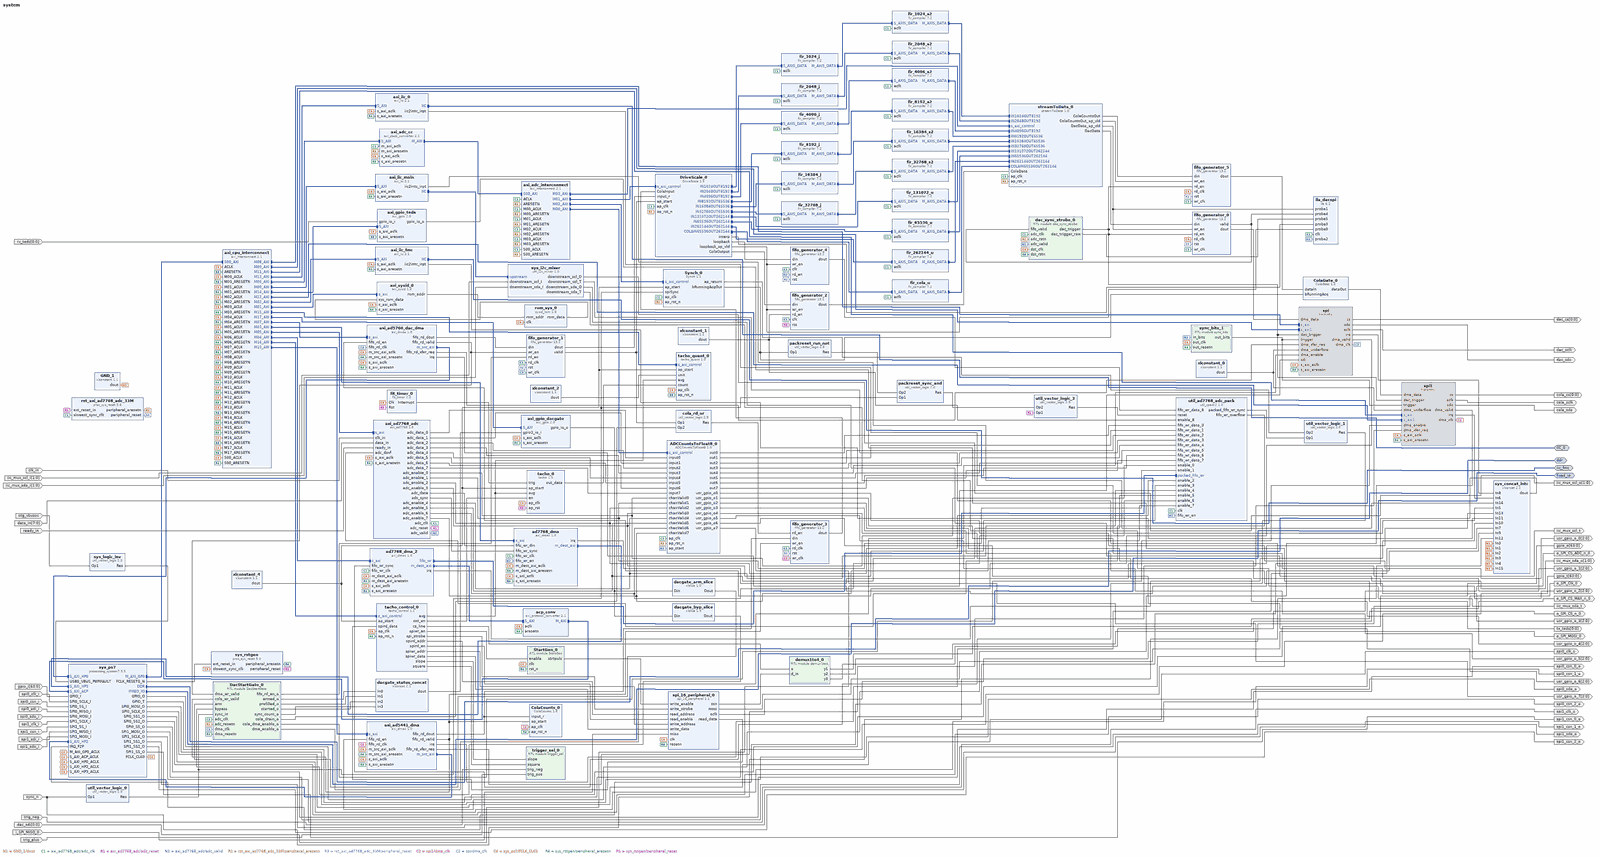
[diagram p0: block diagram of the top level, whole]
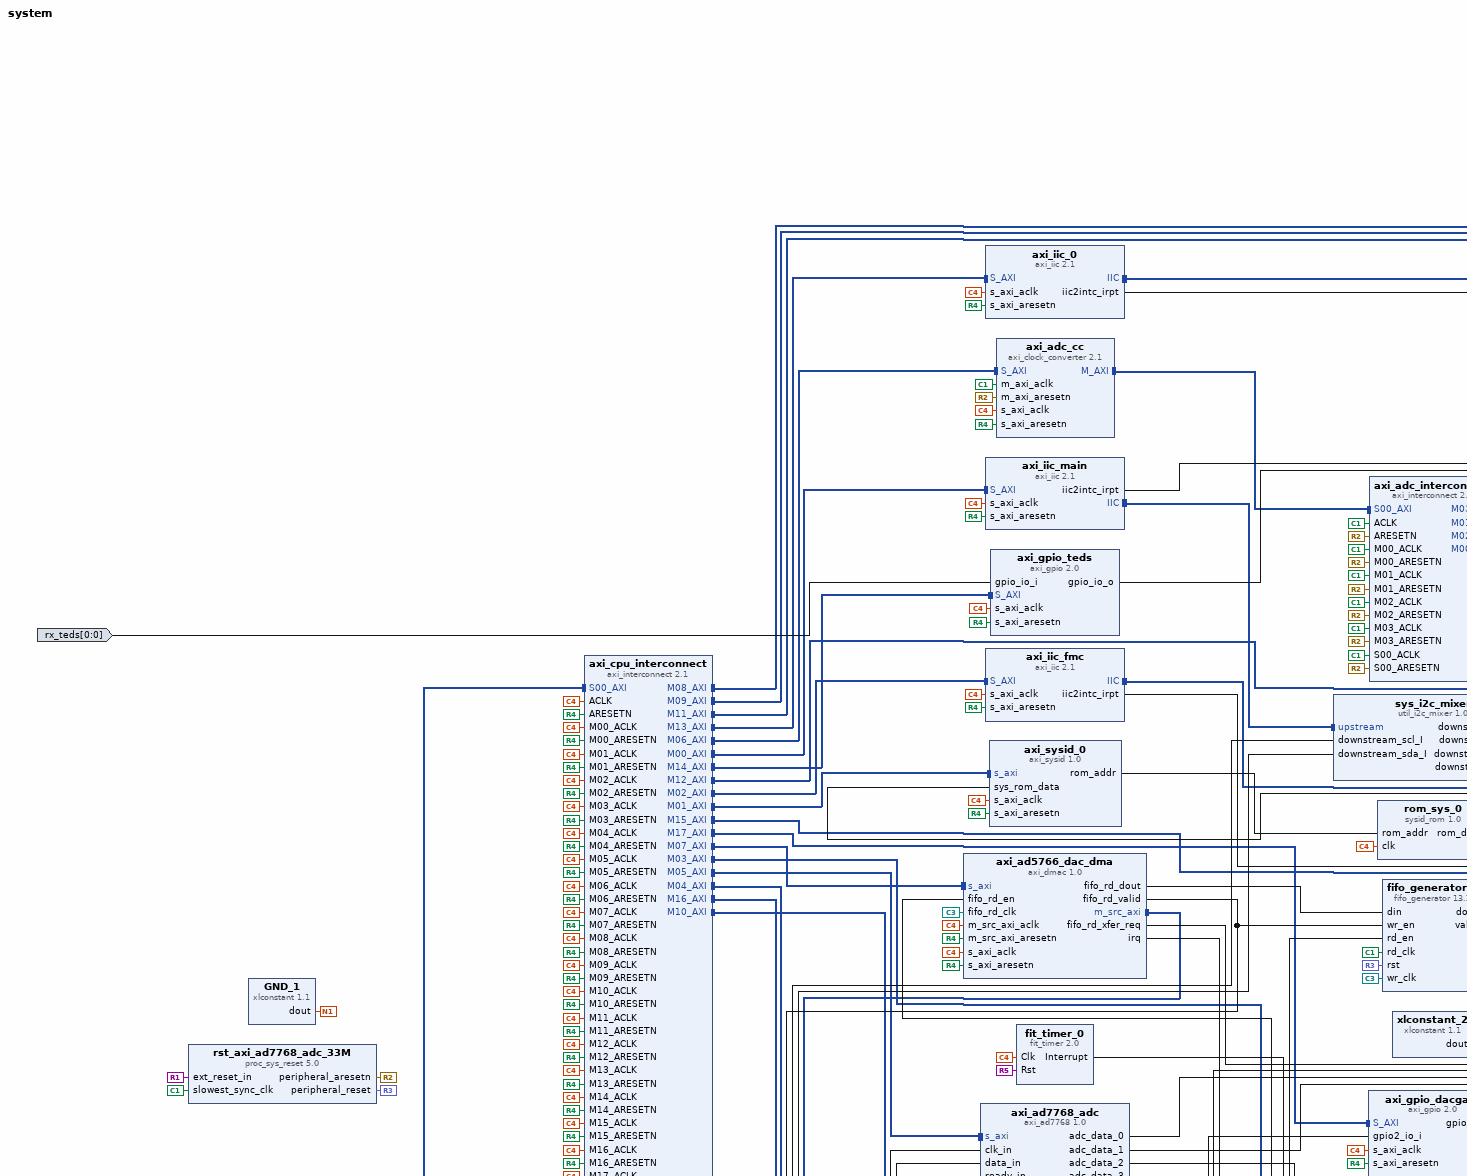
[diagram p1: block diagram of the top level, upper left part]
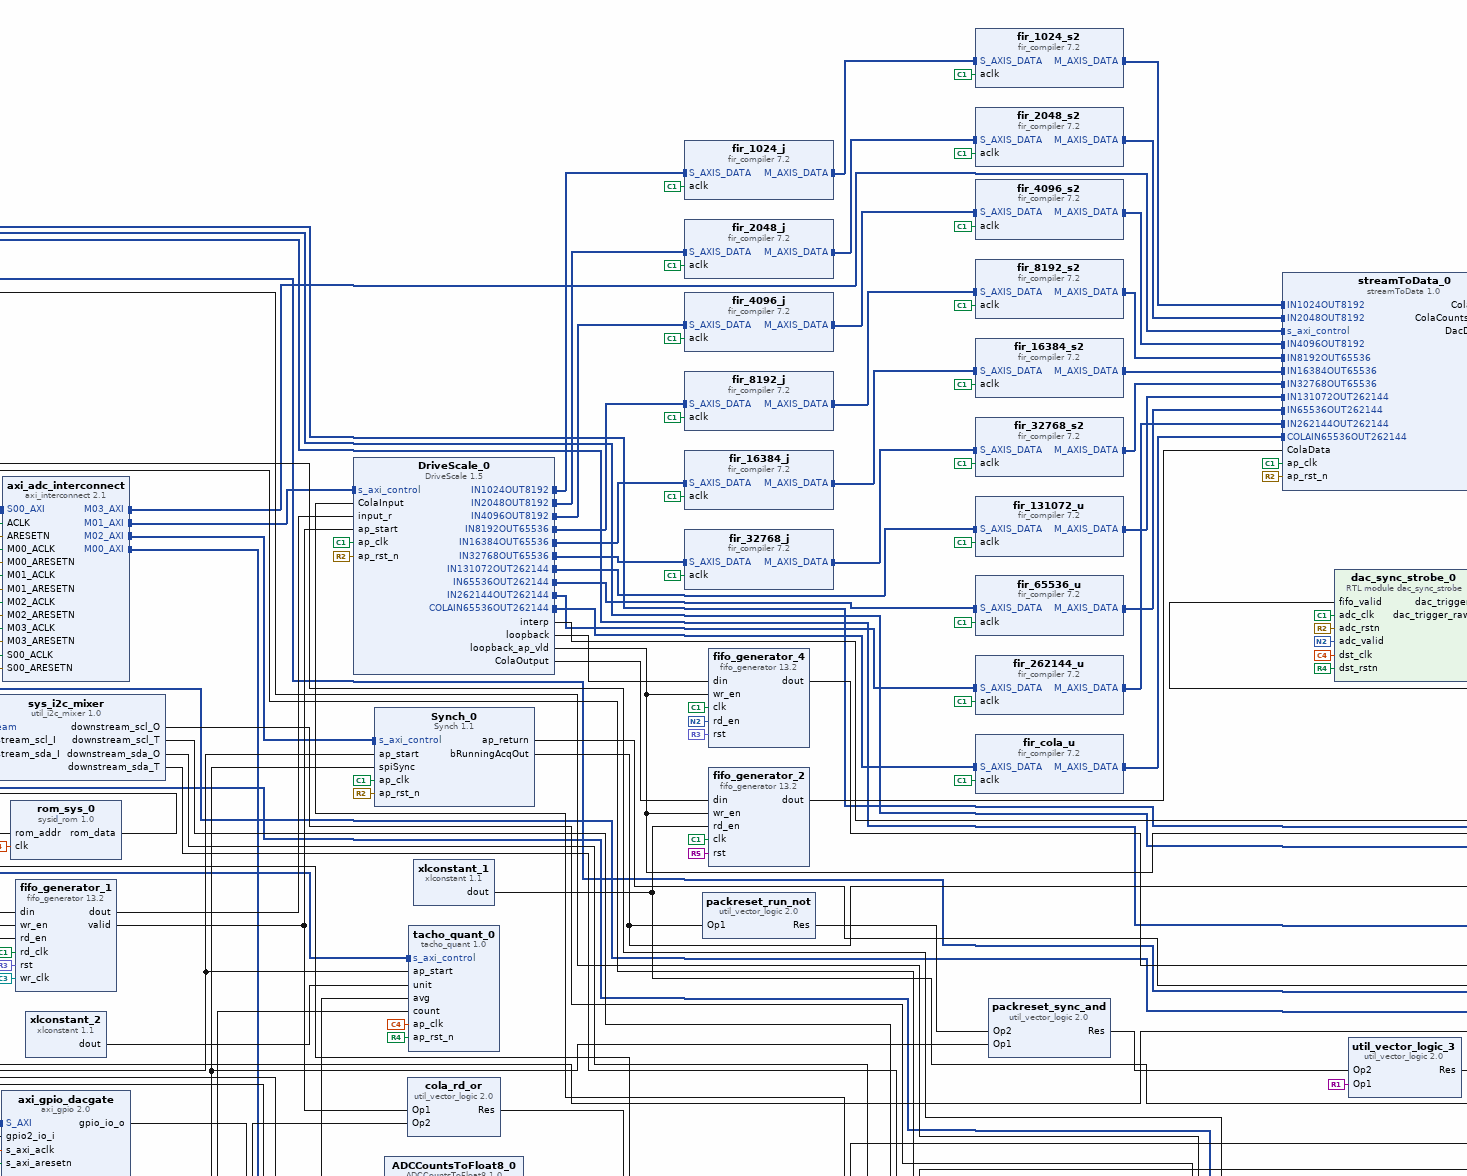
[diagram p2: block diagram of the top level, upper centre part]
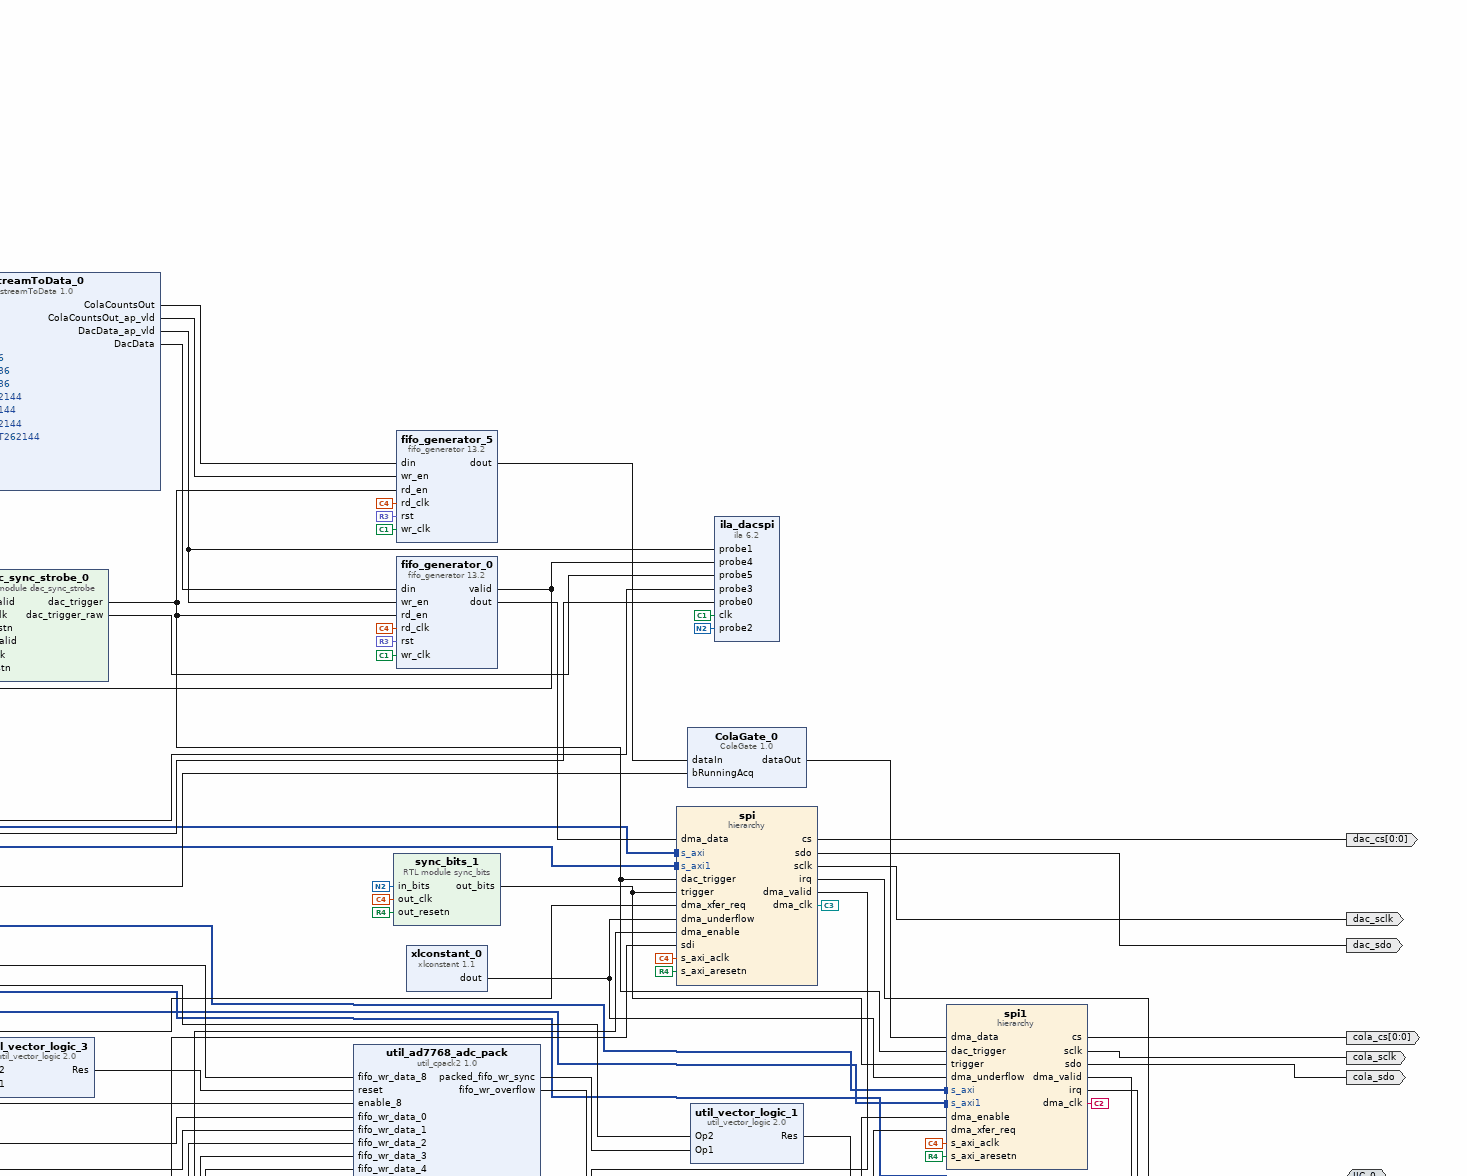
[diagram p3: block diagram of the top level, upper right part]
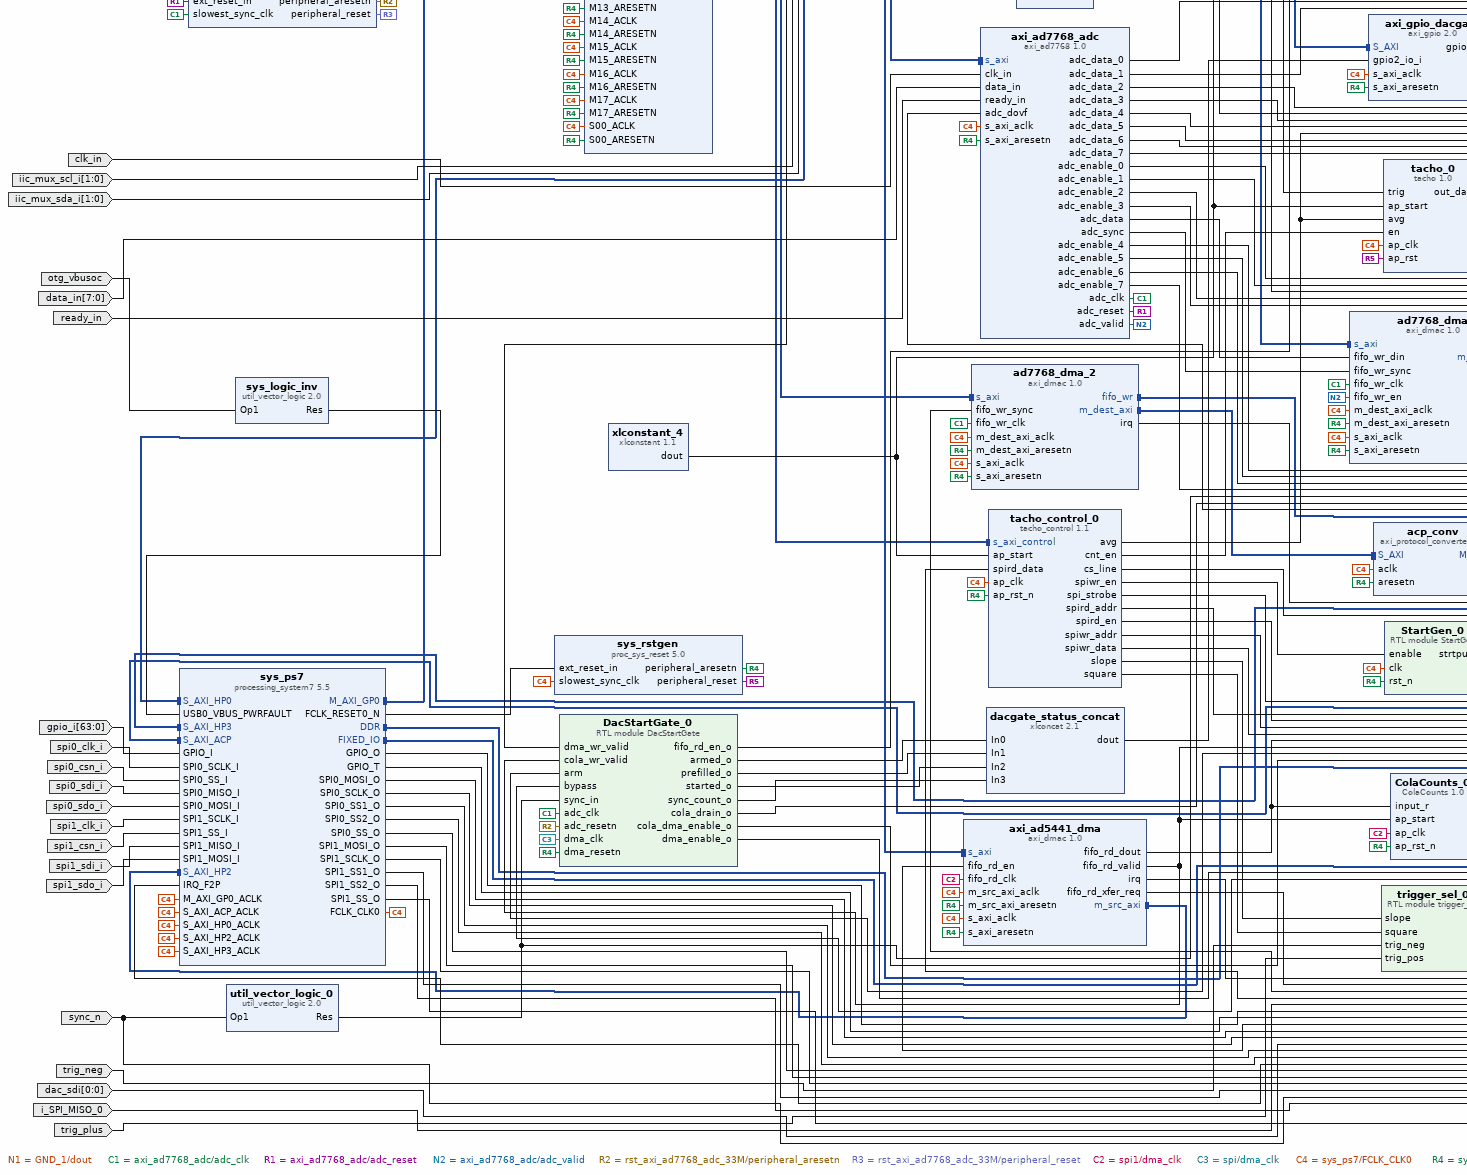
[diagram p4: block diagram of the top level, lower left part]
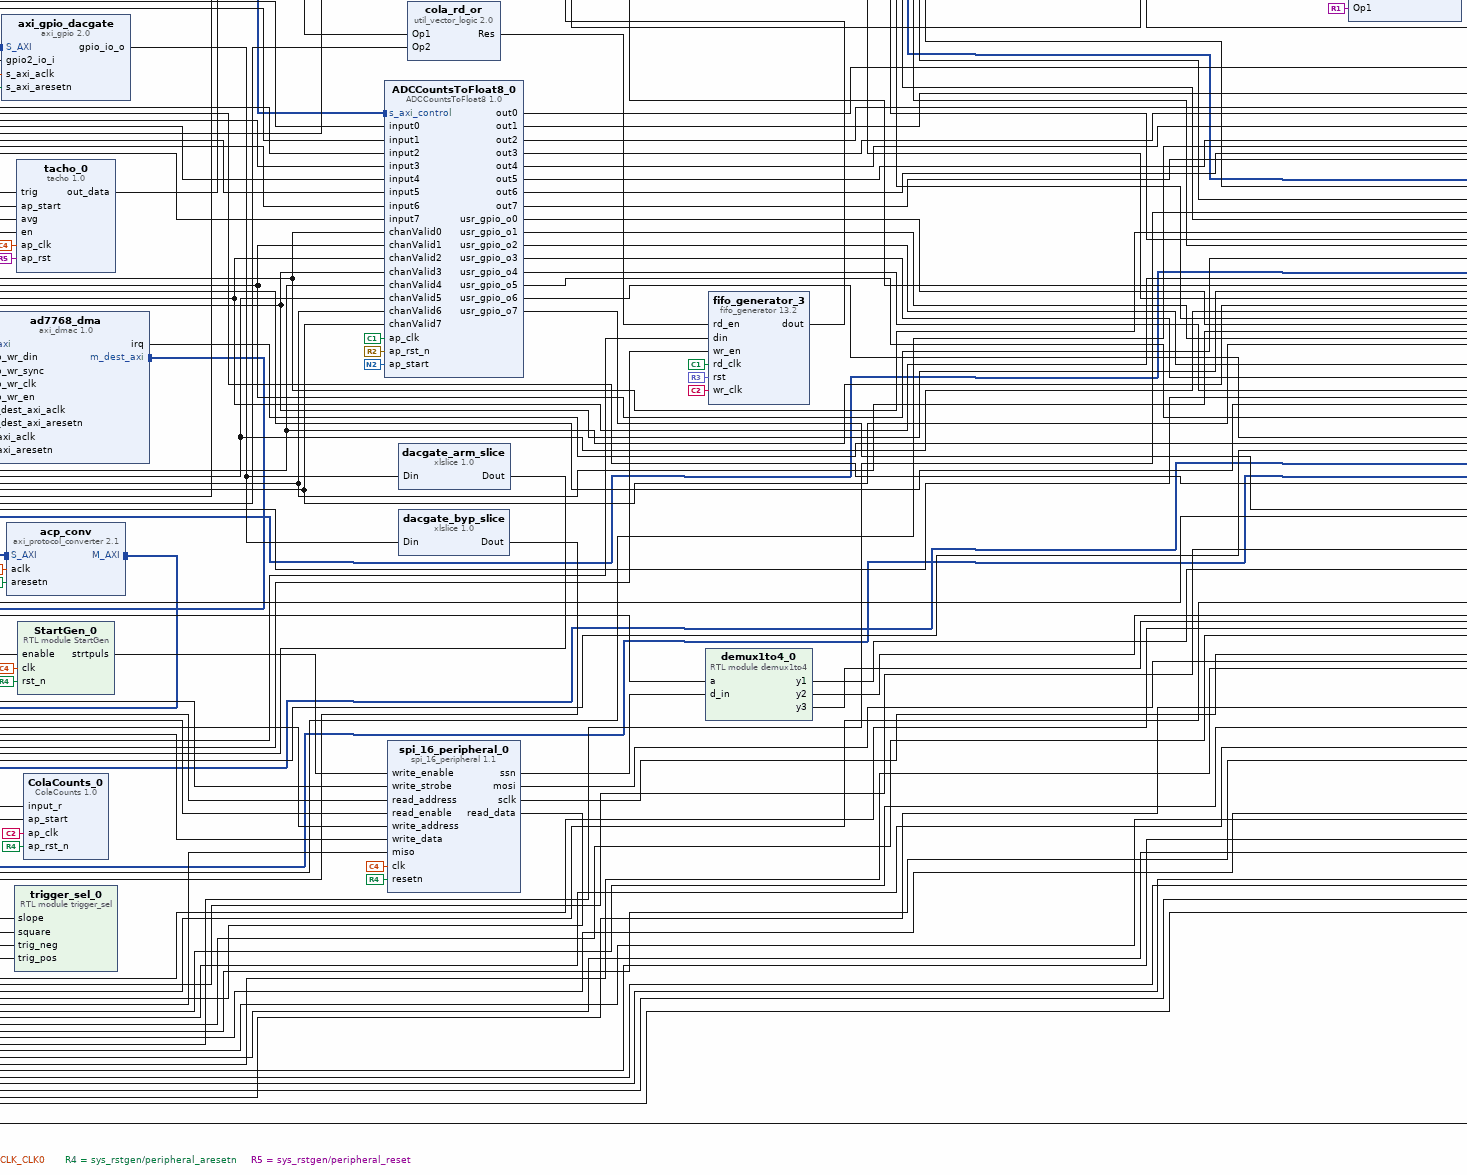
[diagram p5: block diagram of the top level, lower centre part]
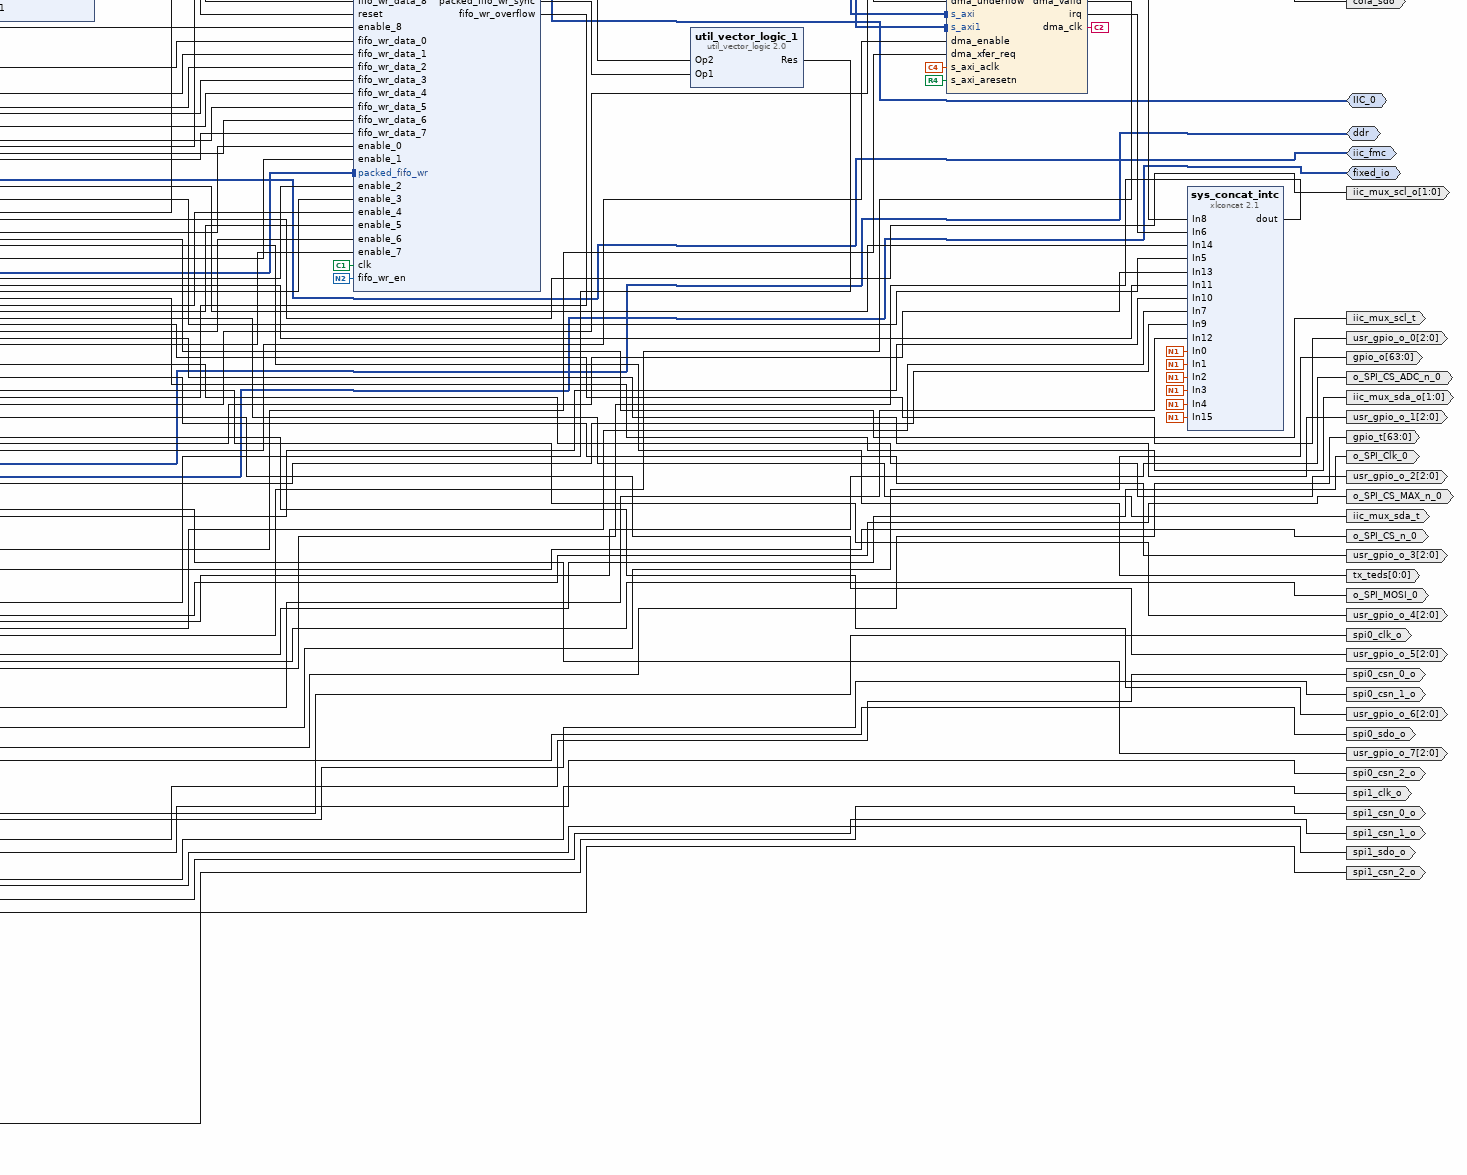
[diagram p6: block diagram of the top level, lower right part]
# Vivado block design system, xc7z020clg484-1, Vivado 2023.2
create_bd_design system

create_bd_intf_port -mode Master -vlnv xilinx.com:interface:ddrx_rtl:1.0 ddr
create_bd_intf_port -mode Master -vlnv xilinx.com:display_processing_system7:fixedio_rtl:1.0 fixed_io
create_bd_intf_port -mode Master -vlnv xilinx.com:interface:iic_rtl:1.0 iic_fmc
create_bd_intf_port -mode Master -vlnv xilinx.com:interface:iic_rtl:1.0 IIC_0
create_bd_port -dir O spi0_csn_2_o
create_bd_port -dir O spi0_csn_1_o
create_bd_port -dir O spi0_csn_0_o
create_bd_port -dir I spi0_csn_i
create_bd_port -dir I spi0_clk_i
create_bd_port -dir O spi0_clk_o
create_bd_port -dir I spi0_sdo_i
create_bd_port -dir O spi0_sdo_o
create_bd_port -dir I spi0_sdi_i
create_bd_port -dir O spi1_csn_2_o
create_bd_port -dir O spi1_csn_1_o
create_bd_port -dir O spi1_csn_0_o
create_bd_port -dir I spi1_csn_i
create_bd_port -dir I spi1_clk_i
create_bd_port -dir O spi1_clk_o
create_bd_port -dir I spi1_sdo_i
create_bd_port -dir O spi1_sdo_o
create_bd_port -dir I spi1_sdi_i
create_bd_port -dir I -from 63 -to 0 gpio_i
create_bd_port -dir O -from 63 -to 0 gpio_o
create_bd_port -dir O -from 63 -to 0 gpio_t
create_bd_port -dir I -from 1 -to 0 iic_mux_scl_i
create_bd_port -dir O -from 1 -to 0 iic_mux_scl_o
create_bd_port -dir O iic_mux_scl_t
create_bd_port -dir I -from 1 -to 0 iic_mux_sda_i
create_bd_port -dir O -from 1 -to 0 iic_mux_sda_o
create_bd_port -dir O iic_mux_sda_t
create_bd_port -dir I otg_vbusoc
create_bd_port -dir I -from 7 -to 0 data_in
create_bd_port -dir O dac_sclk
create_bd_port -dir O -from 0 -to 0 dac_cs
create_bd_port -dir O dac_sdo
create_bd_port -dir I -from 0 -to 0 dac_sdi
create_bd_port -dir O cola_sclk
create_bd_port -dir O cola_sdo
create_bd_port -dir O -from 0 -to 0 cola_cs
create_bd_port -dir O -from 2 -to 0 -type data usr_gpio_o_0
create_bd_port -dir O -from 2 -to 0 -type data usr_gpio_o_1
create_bd_port -dir O -from 2 -to 0 -type data usr_gpio_o_2
create_bd_port -dir O -from 2 -to 0 -type data usr_gpio_o_3
create_bd_port -dir O -from 2 -to 0 -type data usr_gpio_o_4
create_bd_port -dir O -from 2 -to 0 -type data usr_gpio_o_5
create_bd_port -dir O -from 2 -to 0 -type data usr_gpio_o_6
create_bd_port -dir O -from 2 -to 0 -type data usr_gpio_o_7
create_bd_port -dir I -from 0 -to 0 rx_teds
create_bd_port -dir O -from 0 -to 0 tx_teds
create_bd_port -dir I -type intr sync_n
set_property -dict {CONFIG.SENSITIVITY EDGE_RISING} [get_bd_ports sync_n]
create_bd_port -dir I i_SPI_MISO_0
create_bd_port -dir O o_SPI_MOSI_0
create_bd_port -dir O o_SPI_Clk_0
create_bd_port -dir O o_SPI_CS_n_0
create_bd_port -dir O o_SPI_CS_MAX_n_0
create_bd_port -dir O o_SPI_CS_ADC_n_0
create_bd_port -dir I trig_neg
create_bd_port -dir I trig_plus
create_bd_port -dir I -type clk clk_in
set_property -dict {CONFIG.FREQ_HZ 33554432} [get_bd_ports clk_in]
create_bd_port -dir I ready_in

create_bd_cell -type ip -vlnv xilinx.com:ip:processing_system7:5.5 sys_ps7
set_property -dict [list \
  CONFIG.PCW_APU_PERIPHERAL_FREQMHZ 666.666667 \
  CONFIG.PCW_ENET0_ENET0_IO {MIO 16 .. 27} \
  CONFIG.PCW_ENET0_GRP_MDIO_ENABLE 1 \
  CONFIG.PCW_ENET0_GRP_MDIO_IO {MIO 52 .. 53} \
  CONFIG.PCW_ENET0_PERIPHERAL_ENABLE 1 \
  CONFIG.PCW_ENET0_RESET_ENABLE 0 \
  CONFIG.PCW_ENET_RESET_ENABLE 1 \
  CONFIG.PCW_ENET_RESET_SELECT {Share reset pin} \
  CONFIG.PCW_FPGA0_PERIPHERAL_FREQMHZ 100 \
  CONFIG.PCW_FPGA1_PERIPHERAL_FREQMHZ 200.0 \
  CONFIG.PCW_FPGA2_PERIPHERAL_FREQMHZ 32.768 \
  CONFIG.PCW_GPIO_EMIO_GPIO_ENABLE 1 \
  CONFIG.PCW_GPIO_EMIO_GPIO_IO 64 \
  CONFIG.PCW_GPIO_MIO_GPIO_ENABLE 1 \
  CONFIG.PCW_GPIO_MIO_GPIO_IO MIO \
  CONFIG.PCW_I2C_RESET_ENABLE 1 \
  CONFIG.PCW_IMPORT_BOARD_PRESET ZedBoard \
  CONFIG.PCW_IRQ_F2P_INTR 1 \
  CONFIG.PCW_IRQ_F2P_MODE REVERSE \
  CONFIG.PCW_PRESET_BANK1_VOLTAGE {LVCMOS 1.8V} \
  CONFIG.PCW_QSPI_GRP_SINGLE_SS_ENABLE 1 \
  CONFIG.PCW_QSPI_GRP_SINGLE_SS_IO {MIO 1 .. 6} \
  CONFIG.PCW_QSPI_PERIPHERAL_ENABLE 1 \
  CONFIG.PCW_QSPI_QSPI_IO {MIO 1 .. 6} \
  CONFIG.PCW_SD0_GRP_CD_ENABLE 1 \
  CONFIG.PCW_SD0_GRP_CD_IO {MIO 47} \
  CONFIG.PCW_SD0_GRP_WP_ENABLE 1 \
  CONFIG.PCW_SD0_GRP_WP_IO {MIO 46} \
  CONFIG.PCW_SD0_PERIPHERAL_ENABLE 1 \
  CONFIG.PCW_SD0_SD0_IO {MIO 40 .. 45} \
  CONFIG.PCW_SDIO_PERIPHERAL_FREQMHZ 50 \
  CONFIG.PCW_SINGLE_QSPI_DATA_MODE x4 \
  CONFIG.PCW_SPI0_PERIPHERAL_ENABLE 1 \
  CONFIG.PCW_SPI0_SPI0_IO EMIO \
  CONFIG.PCW_SPI1_PERIPHERAL_ENABLE 1 \
  CONFIG.PCW_SPI1_SPI1_IO EMIO \
  CONFIG.PCW_UART1_PERIPHERAL_ENABLE 1 \
  CONFIG.PCW_UART1_UART1_IO {MIO 48 .. 49} \
  CONFIG.PCW_UART_PERIPHERAL_FREQMHZ 50 \
  CONFIG.PCW_UIPARAM_DDR_FREQ_MHZ 533.333313 \
  CONFIG.PCW_UIPARAM_DDR_PARTNO {MT41J128M16 HA-15E} \
  CONFIG.PCW_USB0_PERIPHERAL_ENABLE 1 \
  CONFIG.PCW_USB0_RESET_ENABLE 0 \
  CONFIG.PCW_USB0_USB0_IO {MIO 28 .. 39} \
  CONFIG.PCW_USB_RESET_ENABLE 1 \
  CONFIG.PCW_USB_RESET_SELECT {Share reset pin} \
  CONFIG.PCW_USE_DEFAULT_ACP_USER_VAL 1 \
  CONFIG.PCW_USE_FABRIC_INTERRUPT 1 \
  CONFIG.PCW_USE_S_AXI_ACP 1 \
  CONFIG.PCW_USE_S_AXI_HP0 1 \
  CONFIG.PCW_USE_S_AXI_HP2 1 \
  CONFIG.PCW_USE_S_AXI_HP3 1 \
] [get_bd_cells sys_ps7]
# 431 more settings of sys_ps7 are not shown: defaults, MIO pin electricals, DDR timing, and values the tool derives
create_bd_cell -type ip -vlnv xilinx.com:ip:axi_iic:2.1 axi_iic_main
set_property -dict {CONFIG.IIC_BOARD_INTERFACE Custom CONFIG.USE_BOARD_FLOW true} [get_bd_cells axi_iic_main]
create_bd_cell -type ip -vlnv analog.com:user:util_i2c_mixer:1.0 sys_i2c_mixer
create_bd_cell -type ip -vlnv xilinx.com:ip:xlconcat:2.1 sys_concat_intc
set_property -dict {CONFIG.NUM_PORTS 16} [get_bd_cells sys_concat_intc]
create_bd_cell -type ip -vlnv xilinx.com:ip:proc_sys_reset:5.0 sys_rstgen
set_property -dict {CONFIG.C_EXT_RST_WIDTH 1} [get_bd_cells sys_rstgen]
create_bd_cell -type ip -vlnv xilinx.com:ip:util_vector_logic:2.0 sys_logic_inv
set_property -dict {CONFIG.C_OPERATION not CONFIG.C_SIZE 1} [get_bd_cells sys_logic_inv]
create_bd_cell -type ip -vlnv xilinx.com:ip:axi_iic:2.1 axi_iic_fmc
create_bd_cell -type ip -vlnv analog.com:user:axi_sysid:1.0 axi_sysid_0
set_property -dict {CONFIG.ROM_ADDR_BITS 9} [get_bd_cells axi_sysid_0]
create_bd_cell -type ip -vlnv analog.com:user:sysid_rom:1.0 rom_sys_0
set_property -dict [list \
  CONFIG.PATH_TO_FILE c:/github/hdl-master/projects/ad7768evb/zed/mem_init_sys.txt \
  CONFIG.ROM_ADDR_BITS 9 \
] [get_bd_cells rom_sys_0]
create_bd_cell -type ip -vlnv xilinx.com:ip:xlconstant:1.1 GND_1
set_property -dict {CONFIG.CONST_VAL 0 CONFIG.CONST_WIDTH 1} [get_bd_cells GND_1]
create_bd_cell -type ip -vlnv xilinx.com:ip:axi_interconnect:2.1 axi_cpu_interconnect
set_property -dict {CONFIG.NUM_MI 18} [get_bd_cells axi_cpu_interconnect]
create_bd_cell -type ip -vlnv xilinx.com:ip:axi_clock_converter:2.1 axi_adc_cc
create_bd_cell -type ip -vlnv xilinx.com:ip:axi_interconnect:2.1 axi_adc_interconnect
set_property -dict {CONFIG.NUM_MI 4 CONFIG.NUM_SI 1} [get_bd_cells axi_adc_interconnect]
create_bd_cell -type ip -vlnv analog.com:user:axi_dmac:1.0 ad7768_dma
set_property -dict [list \
  CONFIG.AXI_SLICE_DEST true \
  CONFIG.AXI_SLICE_SRC false \
  CONFIG.CYCLIC false \
  CONFIG.DMA_2D_TRANSFER false \
  CONFIG.DMA_AXI_PROTOCOL_DEST 1 \
  CONFIG.DMA_DATA_WIDTH_SRC 32 \
  CONFIG.DMA_TYPE_DEST 0 \
  CONFIG.DMA_TYPE_SRC 2 \
  CONFIG.SYNC_TRANSFER_START true \
] [get_bd_cells ad7768_dma]
create_bd_cell -type ip -vlnv analog.com:user:axi_dmac:1.0 ad7768_dma_2
set_property -dict [list \
  CONFIG.AXI_SLICE_DEST true \
  CONFIG.AXI_SLICE_SRC false \
  CONFIG.CACHE_COHERENT_DEST true \
  CONFIG.CYCLIC false \
  CONFIG.DMA_2D_TRANSFER false \
  CONFIG.DMA_AXI_PROTOCOL_DEST 0 \
  CONFIG.DMA_DATA_WIDTH_SRC 512 \
  CONFIG.DMA_TYPE_DEST 0 \
  CONFIG.DMA_TYPE_SRC 2 \
  CONFIG.MAX_BYTES_PER_BURST 4096 \
  CONFIG.SYNC_TRANSFER_START true \
] [get_bd_cells ad7768_dma_2]
create_bd_cell -type ip -vlnv xilinx.com:ip:axi_protocol_converter:2.1 acp_conv
create_bd_cell -type ip -vlnv analog.com:user:util_cpack2:1.0 util_ad7768_adc_pack
set_property -dict {CONFIG.NUM_OF_CHANNELS 9 CONFIG.SAMPLE_DATA_WIDTH 32} [get_bd_cells util_ad7768_adc_pack]
create_bd_cell -type ip -vlnv analog.com:user:axi_ad7768:1.0 axi_ad7768_adc
set_property -dict {CONFIG.NUM_CHANNELS 8} [get_bd_cells axi_ad7768_adc]
create_bd_cell -type ip -vlnv xilinx.com:ip:proc_sys_reset:5.0 rst_axi_ad7768_adc_33M
create_bd_cell -type hier spi
create_bd_cell -type ip -vlnv analog.com:user:axi_dmac:1.0 axi_ad5766_dac_dma
set_property -dict [list \
  CONFIG.ASYNC_CLK_SRC_DEST false \
  CONFIG.AXI_SLICE_DEST true \
  CONFIG.AXI_SLICE_SRC true \
  CONFIG.CYCLIC false \
  CONFIG.DMA_AXI_PROTOCOL_SRC 1 \
  CONFIG.DMA_DATA_WIDTH_DEST 32 \
  CONFIG.DMA_TYPE_DEST 2 \
  CONFIG.DMA_TYPE_SRC 0 \
] [get_bd_cells axi_ad5766_dac_dma]
create_bd_cell -type ip -vlnv xilinx.com:ip:xlconstant:1.1 xlconstant_1
create_bd_cell -type hier spi1
create_bd_cell -type ip -vlnv analog.com:user:axi_dmac:1.0 axi_ad5441_dma
set_property -dict [list \
  CONFIG.AXI_SLICE_DEST true \
  CONFIG.AXI_SLICE_SRC true \
  CONFIG.CYCLIC false \
  CONFIG.DMA_AXI_PROTOCOL_SRC 1 \
  CONFIG.DMA_DATA_WIDTH_DEST 32 \
  CONFIG.DMA_TYPE_DEST 2 \
  CONFIG.DMA_TYPE_SRC 0 \
  CONFIG.FIFO_SIZE 32 \
] [get_bd_cells axi_ad5441_dma]
create_bd_cell -type ip -vlnv SpectralDynamics:hls:ColaCounts:1.0 ColaCounts_0
create_bd_cell -type ip -vlnv xilinx.com:ip:axi_iic:2.1 axi_iic_0
create_bd_cell -type ip -vlnv xilinx.com:ip:axi_gpio:2.0 axi_gpio_teds
set_property -dict {CONFIG.C_GPIO_WIDTH 1} [get_bd_cells axi_gpio_teds]
create_bd_cell -type ip -vlnv xilinx.com:ip:util_vector_logic:2.0 util_vector_logic_0
set_property -dict {CONFIG.C_OPERATION not CONFIG.C_SIZE 1} [get_bd_cells util_vector_logic_0]
create_bd_cell -type ip -vlnv xilinx.com:ip:util_vector_logic:2.0 util_vector_logic_1
set_property -dict {CONFIG.C_OPERATION and CONFIG.C_SIZE 1} [get_bd_cells util_vector_logic_1]
create_bd_cell -type ip -vlnv xilinx.com:ip:util_vector_logic:2.0 util_vector_logic_3
set_property -dict {CONFIG.C_OPERATION or CONFIG.C_SIZE 1} [get_bd_cells util_vector_logic_3]
create_bd_cell -type ip -vlnv xilinx.com:hls:ADCCountsToFloat8:1.0 ADCCountsToFloat8_0
create_bd_cell -type ip -vlnv xilinx.com:hls:Synch:1.1 Synch_0
create_bd_cell -type ip -vlnv xilinx.com:ip:fifo_generator:13.2 fifo_generator_0
set_property -dict [list \
  CONFIG.Fifo_Implementation Independent_Clocks_Builtin_FIFO \
  CONFIG.Input_Data_Width 24 \
  CONFIG.Input_Depth 512 \
  CONFIG.Performance_Options First_Word_Fall_Through \
  CONFIG.Read_Clock_Frequency 100 \
  CONFIG.Valid_Flag true \
  CONFIG.Write_Clock_Frequency 33 \
  CONFIG.synchronization_stages 3 \
] [get_bd_cells fifo_generator_0]
create_bd_cell -type ip -vlnv xilinx.com:ip:fifo_generator:13.2 fifo_generator_1
set_property -dict [list \
  CONFIG.Fifo_Implementation Independent_Clocks_Builtin_FIFO \
  CONFIG.INTERFACE_TYPE Native \
  CONFIG.Input_Data_Width 32 \
  CONFIG.Input_Depth 512 \
  CONFIG.Performance_Options Standard_FIFO \
  CONFIG.Read_Clock_Frequency 33 \
  CONFIG.Valid_Flag true \
  CONFIG.Write_Clock_Frequency 100 \
  CONFIG.synchronization_stages 3 \
] [get_bd_cells fifo_generator_1]
create_bd_cell -type ip -vlnv xilinx.com:ip:fir_compiler:7.2 fir_1024_j
set_property -dict [list \
  CONFIG.Clock_Frequency 33.554432 \
  CONFIG.CoefficientSource COE_File \
  CONFIG.Coefficient_File {../../../../../../../../ad7768evb_zed.srcs/sources_1/bd/system/ip/DAC FIR Filters/F1024_x64.coe} \
  CONFIG.Coefficient_Fractional_Bits 32 \
  CONFIG.Coefficient_Sign Signed \
  CONFIG.Coefficient_Structure Inferred \
  CONFIG.Coefficient_Width 33 \
  CONFIG.Data_Width 21 \
  CONFIG.Filter_Architecture Systolic_Multiply_Accumulate \
  CONFIG.Filter_Type Interpolation \
  CONFIG.Interpolation_Rate 64 \
  CONFIG.Optimization_Goal Area \
  CONFIG.Output_Rounding_Mode Truncate_LSBs \
  CONFIG.Output_Width 23 \
  CONFIG.Quantization Quantize_Only \
  CONFIG.RateSpecification Frequency_Specification \
  CONFIG.Sample_Frequency 0.001024 \
] [get_bd_cells fir_1024_j]
create_bd_cell -type ip -vlnv xilinx.com:ip:fir_compiler:7.2 fir_1024_s2
set_property -dict [list \
  CONFIG.Clock_Frequency 33.554432 \
  CONFIG.CoefficientSource COE_File \
  CONFIG.Coefficient_File {../../../../../../../../ad7768evb_zed.srcs/sources_1/bd/system/ip/DAC FIR Filters/TAILD_x4_262144.coe} \
  CONFIG.Coefficient_Fractional_Bits 32 \
  CONFIG.Coefficient_Sign Signed \
  CONFIG.Coefficient_Structure Inferred \
  CONFIG.Coefficient_Width 33 \
  CONFIG.Data_Width 23 \
  CONFIG.Filter_Architecture Systolic_Multiply_Accumulate \
  CONFIG.Filter_Type Interpolation \
  CONFIG.Interpolation_Rate 4 \
  CONFIG.Optimization_Goal Area \
  CONFIG.Output_Rounding_Mode Truncate_LSBs \
  CONFIG.Output_Width 24 \
  CONFIG.Quantization Quantize_Only \
  CONFIG.RateSpecification Frequency_Specification \
  CONFIG.Sample_Frequency 0.065536 \
] [get_bd_cells fir_1024_s2]
create_bd_cell -type ip -vlnv xilinx.com:ip:fir_compiler:7.2 fir_2048_j
set_property -dict [list \
  CONFIG.Clock_Frequency 33.554432 \
  CONFIG.CoefficientSource COE_File \
  CONFIG.Coefficient_File {../../../../../../../../ad7768evb_zed.srcs/sources_1/bd/system/ip/DAC FIR Filters/F2048_x32.coe} \
  CONFIG.Coefficient_Fractional_Bits 32 \
  CONFIG.Coefficient_Sign Signed \
  CONFIG.Coefficient_Structure Inferred \
  CONFIG.Coefficient_Width 33 \
  CONFIG.Data_Width 21 \
  CONFIG.Filter_Architecture Systolic_Multiply_Accumulate \
  CONFIG.Filter_Type Interpolation \
  CONFIG.Interpolation_Rate 32 \
  CONFIG.Optimization_Goal Area \
  CONFIG.Output_Rounding_Mode Truncate_LSBs \
  CONFIG.Output_Width 23 \
  CONFIG.Quantization Quantize_Only \
  CONFIG.RateSpecification Frequency_Specification \
  CONFIG.Sample_Frequency 0.002048 \
] [get_bd_cells fir_2048_j]
create_bd_cell -type ip -vlnv xilinx.com:ip:fir_compiler:7.2 fir_2048_s2
set_property -dict [list \
  CONFIG.Clock_Frequency 33.554432 \
  CONFIG.CoefficientSource COE_File \
  CONFIG.Coefficient_File {../../../../../../../../ad7768evb_zed.srcs/sources_1/bd/system/ip/DAC FIR Filters/TAILD_x4_262144.coe} \
  CONFIG.Coefficient_Fractional_Bits 32 \
  CONFIG.Coefficient_Sign Signed \
  CONFIG.Coefficient_Structure Inferred \
  CONFIG.Coefficient_Width 33 \
  CONFIG.Data_Width 23 \
  CONFIG.Filter_Architecture Systolic_Multiply_Accumulate \
  CONFIG.Filter_Type Interpolation \
  CONFIG.Interpolation_Rate 4 \
  CONFIG.Optimization_Goal Area \
  CONFIG.Output_Rounding_Mode Truncate_LSBs \
  CONFIG.Output_Width 24 \
  CONFIG.Quantization Quantize_Only \
  CONFIG.RateSpecification Frequency_Specification \
  CONFIG.Sample_Frequency 0.065536 \
] [get_bd_cells fir_2048_s2]
create_bd_cell -type ip -vlnv xilinx.com:ip:fir_compiler:7.2 fir_4096_j
set_property -dict [list \
  CONFIG.Clock_Frequency 33.554432 \
  CONFIG.CoefficientSource COE_File \
  CONFIG.Coefficient_File {../../../../../../../../ad7768evb_zed.srcs/sources_1/bd/system/ip/DAC FIR Filters/F4096_x16.coe} \
  CONFIG.Coefficient_Fractional_Bits 32 \
  CONFIG.Coefficient_Sign Signed \
  CONFIG.Coefficient_Structure Inferred \
  CONFIG.Coefficient_Width 33 \
  CONFIG.Data_Width 21 \
  CONFIG.Filter_Architecture Systolic_Multiply_Accumulate \
  CONFIG.Filter_Type Interpolation \
  CONFIG.Interpolation_Rate 16 \
  CONFIG.Optimization_Goal Area \
  CONFIG.Output_Rounding_Mode Truncate_LSBs \
  CONFIG.Output_Width 23 \
  CONFIG.Quantization Quantize_Only \
  CONFIG.RateSpecification Frequency_Specification \
  CONFIG.Sample_Frequency 0.004096 \
] [get_bd_cells fir_4096_j]
create_bd_cell -type ip -vlnv xilinx.com:ip:fir_compiler:7.2 fir_4096_s2
set_property -dict [list \
  CONFIG.Clock_Frequency 33.554432 \
  CONFIG.CoefficientSource COE_File \
  CONFIG.Coefficient_File {../../../../../../../../ad7768evb_zed.srcs/sources_1/bd/system/ip/DAC FIR Filters/TAILD_x4_262144.coe} \
  CONFIG.Coefficient_Fractional_Bits 32 \
  CONFIG.Coefficient_Sign Signed \
  CONFIG.Coefficient_Structure Inferred \
  CONFIG.Coefficient_Width 33 \
  CONFIG.Data_Width 23 \
  CONFIG.Filter_Architecture Systolic_Multiply_Accumulate \
  CONFIG.Filter_Type Interpolation \
  CONFIG.Interpolation_Rate 4 \
  CONFIG.Optimization_Goal Area \
  CONFIG.Output_Rounding_Mode Truncate_LSBs \
  CONFIG.Output_Width 24 \
  CONFIG.Quantization Quantize_Only \
  CONFIG.RateSpecification Frequency_Specification \
  CONFIG.Sample_Frequency 0.065536 \
] [get_bd_cells fir_4096_s2]
create_bd_cell -type ip -vlnv xilinx.com:ip:fir_compiler:7.2 fir_8192_j
set_property -dict [list \
  CONFIG.Clock_Frequency 33.554432 \
  CONFIG.CoefficientSource COE_File \
  CONFIG.Coefficient_File {../../../../../../../../ad7768evb_zed.srcs/sources_1/bd/system/ip/DAC FIR Filters/F8192_x8.coe} \
  CONFIG.Coefficient_Fractional_Bits 32 \
  CONFIG.Coefficient_Sign Signed \
  CONFIG.Coefficient_Structure Inferred \
  CONFIG.Coefficient_Width 33 \
  CONFIG.Data_Width 21 \
  CONFIG.Filter_Architecture Systolic_Multiply_Accumulate \
  CONFIG.Filter_Type Interpolation \
  CONFIG.Interpolation_Rate 8 \
  CONFIG.Optimization_Goal Area \
  CONFIG.Output_Rounding_Mode Truncate_LSBs \
  CONFIG.Output_Width 23 \
  CONFIG.Quantization Quantize_Only \
  CONFIG.RateSpecification Frequency_Specification \
  CONFIG.Sample_Frequency 0.008192 \
] [get_bd_cells fir_8192_j]
create_bd_cell -type ip -vlnv xilinx.com:ip:fir_compiler:7.2 fir_8192_s2
set_property -dict [list \
  CONFIG.Clock_Frequency 33.554432 \
  CONFIG.CoefficientSource COE_File \
  CONFIG.Coefficient_File {../../../../../../../../ad7768evb_zed.srcs/sources_1/bd/system/ip/DAC FIR Filters/TAILD_x4_262144.coe} \
  CONFIG.Coefficient_Fractional_Bits 32 \
  CONFIG.Coefficient_Sign Signed \
  CONFIG.Coefficient_Structure Inferred \
  CONFIG.Coefficient_Width 33 \
  CONFIG.Data_Width 23 \
  CONFIG.Filter_Architecture Systolic_Multiply_Accumulate \
  CONFIG.Filter_Type Interpolation \
  CONFIG.Interpolation_Rate 4 \
  CONFIG.Optimization_Goal Area \
  CONFIG.Output_Rounding_Mode Truncate_LSBs \
  CONFIG.Output_Width 24 \
  CONFIG.Quantization Quantize_Only \
  CONFIG.RateSpecification Frequency_Specification \
  CONFIG.Sample_Frequency 0.065536 \
] [get_bd_cells fir_8192_s2]
create_bd_cell -type ip -vlnv xilinx.com:ip:fir_compiler:7.2 fir_16384_j
set_property -dict [list \
  CONFIG.Clock_Frequency 33.554432 \
  CONFIG.CoefficientSource COE_File \
  CONFIG.Coefficient_File {../../../../../../../../ad7768evb_zed.srcs/sources_1/bd/system/ip/DAC FIR Filters/F16384_x4.coe} \
  CONFIG.Coefficient_Fractional_Bits 32 \
  CONFIG.Coefficient_Sign Signed \
  CONFIG.Coefficient_Structure Inferred \
  CONFIG.Coefficient_Width 33 \
  CONFIG.Data_Width 21 \
  CONFIG.Filter_Architecture Systolic_Multiply_Accumulate \
  CONFIG.Filter_Type Interpolation \
  CONFIG.Interpolation_Rate 4 \
  CONFIG.Optimization_Goal Area \
  CONFIG.Output_Rounding_Mode Truncate_LSBs \
  CONFIG.Output_Width 23 \
  CONFIG.Quantization Quantize_Only \
  CONFIG.RateSpecification Frequency_Specification \
  CONFIG.Sample_Frequency 0.016384 \
] [get_bd_cells fir_16384_j]
create_bd_cell -type ip -vlnv xilinx.com:ip:fir_compiler:7.2 fir_16384_s2
set_property -dict [list \
  CONFIG.Clock_Frequency 33.554432 \
  CONFIG.CoefficientSource COE_File \
  CONFIG.Coefficient_File {../../../../../../../../ad7768evb_zed.srcs/sources_1/bd/system/ip/DAC FIR Filters/TAILD_x4_262144.coe} \
  CONFIG.Coefficient_Fractional_Bits 32 \
  CONFIG.Coefficient_Sign Signed \
  CONFIG.Coefficient_Structure Inferred \
  CONFIG.Coefficient_Width 33 \
  CONFIG.Data_Width 23 \
  CONFIG.Filter_Architecture Systolic_Multiply_Accumulate \
  CONFIG.Filter_Type Interpolation \
  CONFIG.Interpolation_Rate 4 \
  CONFIG.Optimization_Goal Area \
  CONFIG.Output_Rounding_Mode Truncate_LSBs \
  CONFIG.Output_Width 24 \
  CONFIG.Quantization Quantize_Only \
  CONFIG.RateSpecification Frequency_Specification \
  CONFIG.Sample_Frequency 0.065536 \
] [get_bd_cells fir_16384_s2]
create_bd_cell -type ip -vlnv xilinx.com:ip:fir_compiler:7.2 fir_32768_j
set_property -dict [list \
  CONFIG.Clock_Frequency 33.554432 \
  CONFIG.CoefficientSource COE_File \
  CONFIG.Coefficient_File {../../../../../../../../ad7768evb_zed.srcs/sources_1/bd/system/ip/DAC FIR Filters/F32768_x2.coe} \
  CONFIG.Coefficient_Fractional_Bits 32 \
  CONFIG.Coefficient_Sign Signed \
  CONFIG.Coefficient_Structure Inferred \
  CONFIG.Coefficient_Width 33 \
  CONFIG.Data_Width 21 \
  CONFIG.Filter_Architecture Systolic_Multiply_Accumulate \
  CONFIG.Filter_Type Interpolation \
  CONFIG.Interpolation_Rate 2 \
  CONFIG.Optimization_Goal Area \
  CONFIG.Output_Rounding_Mode Truncate_LSBs \
  CONFIG.Output_Width 23 \
  CONFIG.Quantization Quantize_Only \
  CONFIG.RateSpecification Frequency_Specification \
  CONFIG.Sample_Frequency 0.032768 \
] [get_bd_cells fir_32768_j]
create_bd_cell -type ip -vlnv xilinx.com:ip:fir_compiler:7.2 fir_32768_s2
set_property -dict [list \
  CONFIG.Clock_Frequency 33.554432 \
  CONFIG.CoefficientSource COE_File \
  CONFIG.Coefficient_File {../../../../../../../../ad7768evb_zed.srcs/sources_1/bd/system/ip/DAC FIR Filters/TAILD_x4_262144.coe} \
  CONFIG.Coefficient_Fractional_Bits 32 \
  CONFIG.Coefficient_Sign Signed \
  CONFIG.Coefficient_Structure Inferred \
  CONFIG.Coefficient_Width 33 \
  CONFIG.Data_Width 23 \
  CONFIG.Filter_Architecture Systolic_Multiply_Accumulate \
  CONFIG.Filter_Type Interpolation \
  CONFIG.Interpolation_Rate 4 \
  CONFIG.Optimization_Goal Area \
  CONFIG.Output_Rounding_Mode Truncate_LSBs \
  CONFIG.Output_Width 24 \
  CONFIG.Quantization Quantize_Only \
  CONFIG.RateSpecification Frequency_Specification \
  CONFIG.Sample_Frequency 0.065536 \
] [get_bd_cells fir_32768_s2]
create_bd_cell -type ip -vlnv xilinx.com:ip:fir_compiler:7.2 fir_65536_u
set_property -dict [list \
  CONFIG.Clock_Frequency 33.554432 \
  CONFIG.CoefficientSource COE_File \
  CONFIG.Coefficient_File {../../../../../../../../ad7768evb_zed.srcs/sources_1/bd/system/ip/DAC FIR Filters/F65536_x4.coe} \
  CONFIG.Coefficient_Fractional_Bits 32 \
  CONFIG.Coefficient_Sign Signed \
  CONFIG.Coefficient_Structure Inferred \
  CONFIG.Coefficient_Width 33 \
  CONFIG.Data_Width 21 \
  CONFIG.Filter_Architecture Systolic_Multiply_Accumulate \
  CONFIG.Filter_Type Interpolation \
  CONFIG.Interpolation_Rate 4 \
  CONFIG.Optimization_Goal Area \
  CONFIG.Output_Rounding_Mode Truncate_LSBs \
  CONFIG.Output_Width 23 \
  CONFIG.Quantization Quantize_Only \
  CONFIG.RateSpecification Frequency_Specification \
  CONFIG.Sample_Frequency 0.065536 \
] [get_bd_cells fir_65536_u]
create_bd_cell -type ip -vlnv xilinx.com:ip:fir_compiler:7.2 fir_131072_u
set_property -dict [list \
  CONFIG.Clock_Frequency 33.554432 \
  CONFIG.CoefficientSource COE_File \
  CONFIG.Coefficient_File {../../../../../../../../ad7768evb_zed.srcs/sources_1/bd/system/ip/DAC FIR Filters/F131072_x2.coe} \
  CONFIG.Coefficient_Fractional_Bits 32 \
  CONFIG.Coefficient_Sign Signed \
  CONFIG.Coefficient_Structure Inferred \
  CONFIG.Coefficient_Width 33 \
  CONFIG.Data_Width 21 \
  CONFIG.Filter_Architecture Systolic_Multiply_Accumulate \
  CONFIG.Filter_Type Interpolation \
  CONFIG.Interpolation_Rate 2 \
  CONFIG.Optimization_Goal Area \
  CONFIG.Output_Rounding_Mode Truncate_LSBs \
  CONFIG.Output_Width 22 \
  CONFIG.Quantization Quantize_Only \
  CONFIG.RateSpecification Frequency_Specification \
  CONFIG.Sample_Frequency 0.131072 \
] [get_bd_cells fir_131072_u]
create_bd_cell -type ip -vlnv xilinx.com:ip:fir_compiler:7.2 fir_262144_u
set_property -dict [list \
  CONFIG.Clock_Frequency 33.554432 \
  CONFIG.CoefficientSource COE_File \
  CONFIG.Coefficient_File {../../../../../../../../ad7768evb_zed.srcs/sources_1/bd/system/ip/DAC FIR Filters/F262144_x1.coe} \
  CONFIG.Coefficient_Fractional_Bits 32 \
  CONFIG.Coefficient_Sign Signed \
  CONFIG.Coefficient_Structure Inferred \
  CONFIG.Coefficient_Width 33 \
  CONFIG.Data_Width 21 \
  CONFIG.Filter_Architecture Systolic_Multiply_Accumulate \
  CONFIG.Filter_Type Single_Rate \
  CONFIG.Optimization_Goal Area \
  CONFIG.Output_Rounding_Mode Truncate_LSBs \
  CONFIG.Output_Width 22 \
  CONFIG.Quantization Quantize_Only \
  CONFIG.RateSpecification Frequency_Specification \
  CONFIG.Sample_Frequency 0.262144 \
] [get_bd_cells fir_262144_u]
create_bd_cell -type ip -vlnv xilinx.com:ip:fir_compiler:7.2 fir_cola_u
set_property -dict [list \
  CONFIG.Clock_Frequency 33.554432 \
  CONFIG.CoefficientSource COE_File \
  CONFIG.Coefficient_File {../../../../../../../../ad7768evb_zed.srcs/sources_1/bd/system/ip/DAC FIR Filters/COLA_x4.coe} \
  CONFIG.Coefficient_Fractional_Bits 34 \
  CONFIG.Coefficient_Sign Signed \
  CONFIG.Coefficient_Structure Inferred \
  CONFIG.Coefficient_Width 33 \
  CONFIG.Data_Width 16 \
  CONFIG.Filter_Architecture Systolic_Multiply_Accumulate \
  CONFIG.Filter_Type Interpolation \
  CONFIG.Interpolation_Rate 4 \
  CONFIG.Optimization_Goal Area \
  CONFIG.Output_Rounding_Mode Truncate_LSBs \
  CONFIG.Output_Width 19 \
  CONFIG.Quantization Quantize_Only \
  CONFIG.RateSpecification Frequency_Specification \
  CONFIG.Sample_Frequency 0.065536 \
] [get_bd_cells fir_cola_u]
create_bd_cell -type ip -vlnv xilinx.com:ip:ila:6.2 ila_dacspi
set_property -dict [list \
  CONFIG.C_ADV_TRIGGER false \
  CONFIG.C_DATA_DEPTH 16384 \
  CONFIG.C_NUM_OF_PROBES 6 \
  CONFIG.C_PROBE0_WIDTH 1 \
  CONFIG.C_PROBE1_WIDTH 1 \
  CONFIG.C_PROBE2_WIDTH 1 \
  CONFIG.C_PROBE3_WIDTH 4 \
  CONFIG.C_PROBE4_WIDTH 1 \
  CONFIG.C_PROBE5_WIDTH 1 \
  CONFIG.C_TRIGIN_EN false \
] [get_bd_cells ila_dacspi]
create_bd_cell -type ip -vlnv xilinx.com:hls:streamToData:1.0 streamToData_0
create_bd_cell -type ip -vlnv SpectralDynamics:hls:DriveScale:1.5 DriveScale_0
create_bd_cell -type module -reference StartGen StartGen_0
create_bd_cell -type module -reference demux1to4 demux1to4_0
create_bd_cell -type ip -vlnv xilinx.com:hls:tacho:1.0 tacho_0
create_bd_cell -type ip -vlnv xilinx.com:hls:tacho_control:1.1 tacho_control_0
create_bd_cell -type ip -vlnv xilinx.com:user:spi_16_peripheral:1.1 spi_16_peripheral_0
create_bd_cell -type ip -vlnv xilinx.com:ip:xlconstant:1.1 xlconstant_4
create_bd_cell -type ip -vlnv xilinx.com:ip:fifo_generator:13.2 fifo_generator_4
set_property -dict [list \
  CONFIG.Fifo_Implementation Common_Clock_Builtin_FIFO \
  CONFIG.Input_Data_Width 32 \
  CONFIG.Input_Depth 512 \
  CONFIG.Performance_Options First_Word_Fall_Through \
  CONFIG.Valid_Flag false \
] [get_bd_cells fifo_generator_4]
create_bd_cell -type module -reference trigger_sel trigger_sel_0
create_bd_cell -type ip -vlnv xilinx.com:hls:tacho_quant:1.0 tacho_quant_0
create_bd_cell -type ip -vlnv xilinx.com:ip:xlconstant:1.1 xlconstant_2
set_property -dict {CONFIG.CONST_VAL 0 CONFIG.CONST_WIDTH 4} [get_bd_cells xlconstant_2]
create_bd_cell -type ip -vlnv xilinx.com:ip:fit_timer:2.0 fit_timer_0
set_property -dict {CONFIG.C_NO_CLOCKS 1000000} [get_bd_cells fit_timer_0]
create_bd_cell -type module -reference sync_bits sync_bits_1
create_bd_cell -type module -reference dac_sync_strobe dac_sync_strobe_0
create_bd_cell -type ip -vlnv xilinx.com:ip:xlconstant:1.1 xlconstant_0
set_property -dict {CONFIG.CONST_VAL 0} [get_bd_cells xlconstant_0]
create_bd_cell -type ip -vlnv xilinx.com:ip:fifo_generator:13.2 fifo_generator_2
set_property -dict [list \
  CONFIG.Fifo_Implementation Common_Clock_Builtin_FIFO \
  CONFIG.Input_Data_Width 16 \
  CONFIG.Input_Depth 512 \
] [get_bd_cells fifo_generator_2]
create_bd_cell -type ip -vlnv xilinx.com:ip:fifo_generator:13.2 fifo_generator_3
set_property -dict [list \
  CONFIG.Fifo_Implementation Independent_Clocks_Builtin_FIFO \
  CONFIG.Input_Data_Width 32 \
  CONFIG.Input_Depth 512 \
] [get_bd_cells fifo_generator_3]
create_bd_cell -type ip -vlnv xilinx.com:ip:fifo_generator:13.2 fifo_generator_5
set_property -dict [list \
  CONFIG.Fifo_Implementation Independent_Clocks_Builtin_FIFO \
  CONFIG.Input_Data_Width 16 \
  CONFIG.Input_Depth 512 \
  CONFIG.Performance_Options First_Word_Fall_Through \
  CONFIG.Read_Clock_Frequency 100 \
  CONFIG.Write_Clock_Frequency 33 \
  CONFIG.synchronization_stages 3 \
] [get_bd_cells fifo_generator_5]
create_bd_cell -type ip -vlnv xilinx.com:hls:ColaGate:1.0 ColaGate_0
create_bd_cell -type module -reference DacStartGate DacStartGate_0
set_property -dict {CONFIG.PREFILL_DEPTH 16 CONFIG.RD_CLOSE_WAIT 64} [get_bd_cells DacStartGate_0]
create_bd_cell -type ip -vlnv xilinx.com:ip:axi_gpio:2.0 axi_gpio_dacgate
set_property -dict [list \
  CONFIG.C_ALL_INPUTS_2 1 \
  CONFIG.C_ALL_OUTPUTS 1 \
  CONFIG.C_DOUT_DEFAULT 0x00000002 \
  CONFIG.C_GPIO2_WIDTH 19 \
  CONFIG.C_GPIO_WIDTH 2 \
  CONFIG.C_IS_DUAL 1 \
] [get_bd_cells axi_gpio_dacgate]
create_bd_cell -type ip -vlnv xilinx.com:ip:xlslice:1.0 dacgate_arm_slice
set_property -dict {CONFIG.DIN_FROM 0 CONFIG.DIN_TO 0 CONFIG.DIN_WIDTH 2 CONFIG.DOUT_WIDTH 1} [get_bd_cells dacgate_arm_slice]
create_bd_cell -type ip -vlnv xilinx.com:ip:xlslice:1.0 dacgate_byp_slice
set_property -dict {CONFIG.DIN_FROM 1 CONFIG.DIN_TO 1 CONFIG.DIN_WIDTH 2 CONFIG.DOUT_WIDTH 1} [get_bd_cells dacgate_byp_slice]
create_bd_cell -type ip -vlnv xilinx.com:ip:xlconcat:2.1 dacgate_status_concat
set_property -dict [list \
  CONFIG.IN0_WIDTH 1 \
  CONFIG.IN1_WIDTH 1 \
  CONFIG.IN2_WIDTH 1 \
  CONFIG.IN3_WIDTH 16 \
  CONFIG.NUM_PORTS 4 \
] [get_bd_cells dacgate_status_concat]
create_bd_cell -type ip -vlnv xilinx.com:ip:util_vector_logic:2.0 packreset_run_not
set_property -dict {CONFIG.C_OPERATION not CONFIG.C_SIZE 1} [get_bd_cells packreset_run_not]
create_bd_cell -type ip -vlnv xilinx.com:ip:util_vector_logic:2.0 packreset_sync_and
set_property -dict {CONFIG.C_OPERATION and CONFIG.C_SIZE 1} [get_bd_cells packreset_sync_and]
create_bd_cell -type ip -vlnv xilinx.com:ip:util_vector_logic:2.0 cola_rd_or
set_property -dict {CONFIG.C_OPERATION or CONFIG.C_SIZE 1} [get_bd_cells cola_rd_or]

# ---- hierarchy /spi ----
current_bd_instance /spi
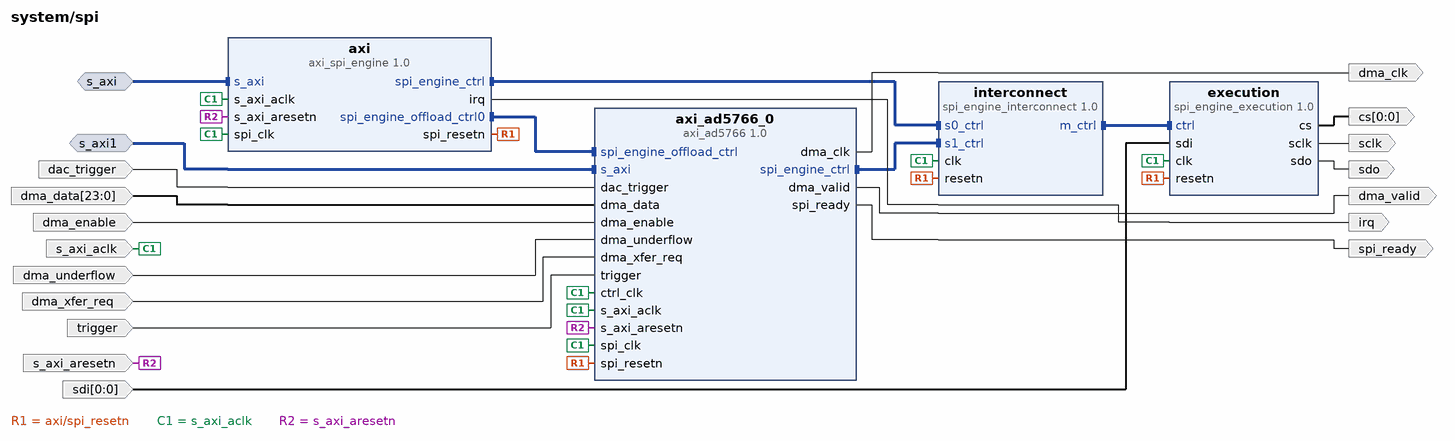
[diagram p7: block diagram inside /spi]
create_bd_intf_pin -mode Slave -vlnv xilinx.com:interface:aximm_rtl:1.0 s_axi
create_bd_intf_pin -mode Slave -vlnv xilinx.com:interface:aximm_rtl:1.0 s_axi1
create_bd_pin -dir I -type clk s_axi_aclk
create_bd_pin -dir I trigger
create_bd_pin -dir I dma_enable
create_bd_pin -dir O -type clk dma_clk
create_bd_pin -dir O dma_valid
create_bd_pin -dir O irq
create_bd_pin -dir I dma_xfer_req
create_bd_pin -dir I dma_underflow
create_bd_pin -dir I -type rst s_axi_aresetn
create_bd_pin -dir O sclk
create_bd_pin -dir O -from 0 -to 0 cs
create_bd_pin -dir O sdo
create_bd_pin -dir I -from 0 -to 0 sdi
create_bd_pin -dir I -from 23 -to 0 dma_data
create_bd_pin -dir I dac_trigger
create_bd_pin -dir O spi_ready

create_bd_cell -type ip -vlnv analog.com:user:axi_spi_engine:1.0 axi
set_property -dict {CONFIG.ASYNC_SPI_CLK true CONFIG.DATA_WIDTH 24 CONFIG.NUM_OFFLOAD 1} [get_bd_cells axi]
create_bd_cell -type ip -vlnv analog.com:user:spi_engine_execution:1.0 execution
set_property -dict {CONFIG.DATA_WIDTH 24 CONFIG.DEFAULT_CLK_DIV 2 CONFIG.DEFAULT_SPI_CFG 3} [get_bd_cells execution]
create_bd_cell -type ip -vlnv analog.com:user:spi_engine_interconnect:1.0 interconnect
set_property -dict {CONFIG.DATA_WIDTH 24} [get_bd_cells interconnect]
create_bd_cell -type ip -vlnv analog.com:user:axi_ad5766:1.0 axi_ad5766_0

# ---- hierarchy /spi1 ----
current_bd_instance /spi1
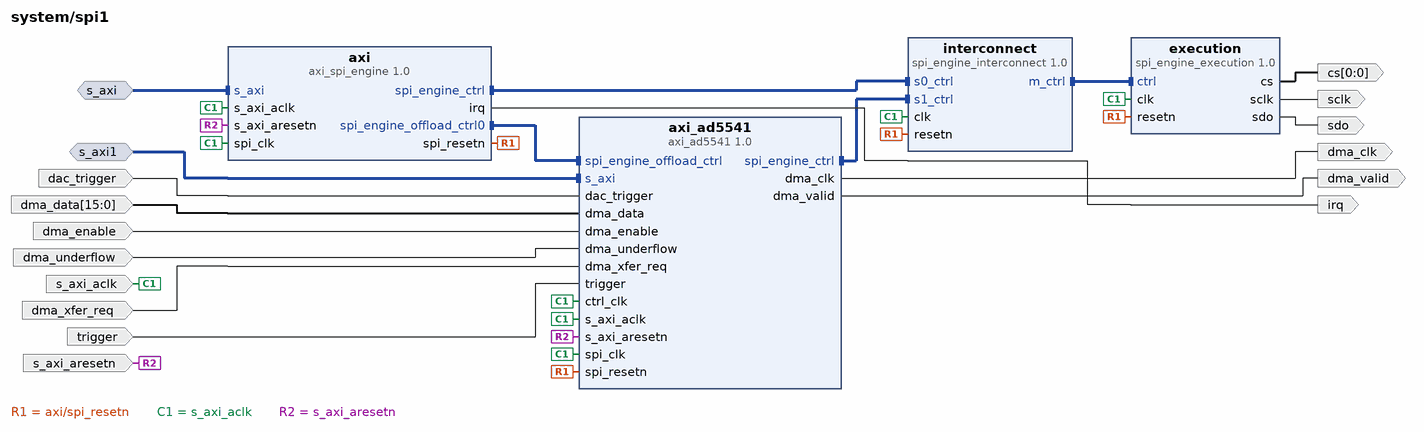
[diagram p8: block diagram inside /spi1]
create_bd_intf_pin -mode Slave -vlnv xilinx.com:interface:aximm_rtl:1.0 s_axi
create_bd_intf_pin -mode Slave -vlnv xilinx.com:interface:aximm_rtl:1.0 s_axi1
create_bd_pin -dir I -type clk s_axi_aclk
create_bd_pin -dir O sclk
create_bd_pin -dir O sdo
create_bd_pin -dir O -from 0 -to 0 cs
create_bd_pin -dir I -type rst s_axi_aresetn
create_bd_pin -dir I trigger
create_bd_pin -dir I dma_enable
create_bd_pin -dir I -from 15 -to 0 dma_data
create_bd_pin -dir I dac_trigger
create_bd_pin -dir O -type clk dma_clk
create_bd_pin -dir O dma_valid
create_bd_pin -dir I dma_xfer_req
create_bd_pin -dir I dma_underflow
create_bd_pin -dir O irq

create_bd_cell -type ip -vlnv analog.com:user:axi_spi_engine:1.0 axi
set_property -dict {CONFIG.ASYNC_SPI_CLK true CONFIG.DATA_WIDTH 16 CONFIG.NUM_OFFLOAD 1} [get_bd_cells axi]
create_bd_cell -type ip -vlnv analog.com:user:spi_engine_execution:1.0 execution
set_property -dict {CONFIG.DATA_WIDTH 16} [get_bd_cells execution]
create_bd_cell -type ip -vlnv analog.com:user:spi_engine_interconnect:1.0 interconnect
set_property -dict {CONFIG.DATA_WIDTH 16} [get_bd_cells interconnect]
create_bd_cell -type ip -vlnv analog.com:user:axi_ad5541:1.0 axi_ad5541

# ---- connections ----

current_bd_instance /spi
connect_bd_intf_net [get_bd_intf_pins axi/s_axi] [get_bd_intf_pins s_axi]
connect_bd_intf_net [get_bd_intf_pins axi_ad5766_0/s_axi] [get_bd_intf_pins s_axi1]
connect_bd_intf_net [get_bd_intf_pins axi_ad5766_0/spi_engine_ctrl] [get_bd_intf_pins interconnect/s1_ctrl]
connect_bd_intf_net [get_bd_intf_pins axi/spi_engine_ctrl] [get_bd_intf_pins interconnect/s0_ctrl]
connect_bd_intf_net [get_bd_intf_pins axi/spi_engine_offload_ctrl0] [get_bd_intf_pins axi_ad5766_0/spi_engine_offload_ctrl]
connect_bd_intf_net [get_bd_intf_pins interconnect/m_ctrl] [get_bd_intf_pins execution/ctrl]
connect_bd_net [get_bd_pins axi_ad5766_0/dma_clk] [get_bd_pins dma_clk]
connect_bd_net [get_bd_pins axi_ad5766_0/dma_valid] [get_bd_pins dma_valid]
connect_bd_net [get_bd_pins axi_ad5766_0/spi_ready] [get_bd_pins spi_ready]
connect_bd_net [get_bd_pins axi/irq] [get_bd_pins irq]
connect_bd_net [get_bd_pins axi/spi_resetn] [get_bd_pins execution/resetn] [get_bd_pins interconnect/resetn] [get_bd_pins axi_ad5766_0/spi_resetn]
connect_bd_net [get_bd_pins dac_trigger] [get_bd_pins axi_ad5766_0/dac_trigger]
connect_bd_net [get_bd_pins dma_data] [get_bd_pins axi_ad5766_0/dma_data]
connect_bd_net [get_bd_pins dma_enable] [get_bd_pins axi_ad5766_0/dma_enable]
connect_bd_net [get_bd_pins dma_underflow] [get_bd_pins axi_ad5766_0/dma_underflow]
connect_bd_net [get_bd_pins dma_xfer_req] [get_bd_pins axi_ad5766_0/dma_xfer_req]
connect_bd_net [get_bd_pins execution/cs] [get_bd_pins cs]
connect_bd_net [get_bd_pins execution/sclk] [get_bd_pins sclk]
connect_bd_net [get_bd_pins execution/sdo] [get_bd_pins sdo]
connect_bd_net [get_bd_pins s_axi_aclk] \
  [get_bd_pins axi/s_axi_aclk] [get_bd_pins execution/clk] [get_bd_pins interconnect/clk] [get_bd_pins axi/spi_clk] \
  [get_bd_pins axi_ad5766_0/s_axi_aclk] [get_bd_pins axi_ad5766_0/spi_clk] [get_bd_pins axi_ad5766_0/ctrl_clk]
connect_bd_net [get_bd_pins s_axi_aresetn] [get_bd_pins axi/s_axi_aresetn] [get_bd_pins axi_ad5766_0/s_axi_aresetn]
connect_bd_net -net sdi_0_1 [get_bd_pins sdi] [get_bd_pins execution/sdi]
connect_bd_net [get_bd_pins trigger] [get_bd_pins axi_ad5766_0/trigger]

current_bd_instance /spi1
connect_bd_intf_net [get_bd_intf_pins axi/s_axi] [get_bd_intf_pins s_axi]
connect_bd_intf_net [get_bd_intf_pins axi_ad5541/s_axi] [get_bd_intf_pins s_axi1]
connect_bd_intf_net -intf_net axi_ad5541_0_spi_engine_ctrl [get_bd_intf_pins interconnect/s1_ctrl] [get_bd_intf_pins axi_ad5541/spi_engine_ctrl]
connect_bd_intf_net [get_bd_intf_pins axi/spi_engine_ctrl] [get_bd_intf_pins interconnect/s0_ctrl]
connect_bd_intf_net [get_bd_intf_pins axi/spi_engine_offload_ctrl0] [get_bd_intf_pins axi_ad5541/spi_engine_offload_ctrl]
connect_bd_intf_net [get_bd_intf_pins interconnect/m_ctrl] [get_bd_intf_pins execution/ctrl]
connect_bd_net [get_bd_pins axi/spi_resetn] [get_bd_pins interconnect/resetn] [get_bd_pins execution/resetn] [get_bd_pins axi_ad5541/spi_resetn]
connect_bd_net -net axi_ad5541_0_dma_clk [get_bd_pins axi_ad5541/dma_clk] [get_bd_pins dma_clk]
connect_bd_net -net axi_ad5541_0_dma_valid [get_bd_pins axi_ad5541/dma_valid] [get_bd_pins dma_valid]
connect_bd_net [get_bd_pins axi/irq] [get_bd_pins irq]
connect_bd_net [get_bd_pins dac_trigger] [get_bd_pins axi_ad5541/dac_trigger]
connect_bd_net [get_bd_pins dma_data] [get_bd_pins axi_ad5541/dma_data]
connect_bd_net [get_bd_pins dma_enable] [get_bd_pins axi_ad5541/dma_enable]
connect_bd_net [get_bd_pins dma_underflow] [get_bd_pins axi_ad5541/dma_underflow]
connect_bd_net [get_bd_pins dma_xfer_req] [get_bd_pins axi_ad5541/dma_xfer_req]
connect_bd_net [get_bd_pins s_axi_aclk] \
  [get_bd_pins axi/s_axi_aclk] [get_bd_pins axi/spi_clk] [get_bd_pins interconnect/clk] [get_bd_pins execution/clk] \
  [get_bd_pins axi_ad5541/s_axi_aclk] [get_bd_pins axi_ad5541/spi_clk] [get_bd_pins axi_ad5541/ctrl_clk]
connect_bd_net [get_bd_pins s_axi_aresetn] [get_bd_pins axi/s_axi_aresetn] [get_bd_pins axi_ad5541/s_axi_aresetn]
connect_bd_net -net spi_engine_execution_0_cs [get_bd_pins execution/cs] [get_bd_pins cs]
connect_bd_net -net spi_engine_execution_0_sclk [get_bd_pins execution/sclk] [get_bd_pins sclk]
connect_bd_net -net spi_engine_execution_0_sdo [get_bd_pins execution/sdo] [get_bd_pins sdo]
connect_bd_net [get_bd_pins trigger] [get_bd_pins axi_ad5541/trigger]

current_bd_instance /
connect_bd_intf_net [get_bd_intf_pins DriveScale_0/COLAIN65536OUT262144] [get_bd_intf_pins fir_cola_u/S_AXIS_DATA]
connect_bd_intf_net [get_bd_intf_pins DriveScale_0/IN1024OUT8192] [get_bd_intf_pins fir_1024_j/S_AXIS_DATA]
connect_bd_intf_net [get_bd_intf_pins DriveScale_0/IN131072OUT262144] [get_bd_intf_pins fir_131072_u/S_AXIS_DATA]
connect_bd_intf_net [get_bd_intf_pins DriveScale_0/IN16384OUT65536] [get_bd_intf_pins fir_16384_j/S_AXIS_DATA]
connect_bd_intf_net [get_bd_intf_pins DriveScale_0/IN2048OUT8192] [get_bd_intf_pins fir_2048_j/S_AXIS_DATA]
connect_bd_intf_net [get_bd_intf_pins DriveScale_0/IN262144OUT262144] [get_bd_intf_pins fir_262144_u/S_AXIS_DATA]
connect_bd_intf_net [get_bd_intf_pins DriveScale_0/IN32768OUT65536] [get_bd_intf_pins fir_32768_j/S_AXIS_DATA]
connect_bd_intf_net [get_bd_intf_pins DriveScale_0/IN4096OUT8192] [get_bd_intf_pins fir_4096_j/S_AXIS_DATA]
connect_bd_intf_net [get_bd_intf_pins DriveScale_0/IN65536OUT262144] [get_bd_intf_pins fir_65536_u/S_AXIS_DATA]
connect_bd_intf_net [get_bd_intf_pins DriveScale_0/IN8192OUT65536] [get_bd_intf_pins fir_8192_j/S_AXIS_DATA]
connect_bd_intf_net [get_bd_intf_pins axi_cpu_interconnect/S00_AXI] [get_bd_intf_pins sys_ps7/M_AXI_GP0]
connect_bd_intf_net [get_bd_intf_pins acp_conv/M_AXI] [get_bd_intf_pins sys_ps7/S_AXI_ACP]
connect_bd_intf_net [get_bd_intf_pins ad7768_dma_2/m_dest_axi] [get_bd_intf_pins acp_conv/S_AXI]
connect_bd_intf_net [get_bd_intf_pins ad7768_dma/m_dest_axi] [get_bd_intf_pins sys_ps7/S_AXI_HP3]
connect_bd_intf_net [get_bd_intf_pins axi_ad5441_dma/m_src_axi] [get_bd_intf_pins sys_ps7/S_AXI_HP2]
connect_bd_intf_net [get_bd_intf_pins axi_ad5766_dac_dma/m_src_axi] [get_bd_intf_pins sys_ps7/S_AXI_HP0]
connect_bd_intf_net [get_bd_intf_pins axi_adc_cc/M_AXI] [get_bd_intf_pins axi_adc_interconnect/S00_AXI]
connect_bd_intf_net [get_bd_intf_pins axi_adc_interconnect/M00_AXI] [get_bd_intf_pins ADCCountsToFloat8_0/s_axi_control]
connect_bd_intf_net [get_bd_intf_pins axi_adc_interconnect/M01_AXI] [get_bd_intf_pins DriveScale_0/s_axi_control]
connect_bd_intf_net [get_bd_intf_pins axi_adc_interconnect/M02_AXI] [get_bd_intf_pins Synch_0/s_axi_control]
connect_bd_intf_net [get_bd_intf_pins axi_adc_interconnect/M03_AXI] [get_bd_intf_pins streamToData_0/s_axi_control]
connect_bd_intf_net [get_bd_intf_pins axi_cpu_interconnect/M00_AXI] [get_bd_intf_pins axi_iic_main/S_AXI]
connect_bd_intf_net [get_bd_intf_pins axi_cpu_interconnect/M01_AXI] [get_bd_intf_pins axi_sysid_0/s_axi]
connect_bd_intf_net [get_bd_intf_pins axi_cpu_interconnect/M02_AXI] [get_bd_intf_pins axi_iic_fmc/S_AXI]
connect_bd_intf_net [get_bd_intf_pins axi_cpu_interconnect/M03_AXI] [get_bd_intf_pins ad7768_dma/s_axi]
connect_bd_intf_net [get_bd_intf_pins axi_cpu_interconnect/M04_AXI] [get_bd_intf_pins ad7768_dma_2/s_axi]
connect_bd_intf_net [get_bd_intf_pins axi_cpu_interconnect/M05_AXI] [get_bd_intf_pins axi_ad7768_adc/s_axi]
connect_bd_intf_net [get_bd_intf_pins axi_cpu_interconnect/M06_AXI] [get_bd_intf_pins axi_adc_cc/S_AXI]
connect_bd_intf_net [get_bd_intf_pins axi_cpu_interconnect/M07_AXI] [get_bd_intf_pins axi_ad5766_dac_dma/s_axi]
connect_bd_intf_net [get_bd_intf_pins axi_cpu_interconnect/M08_AXI] [get_bd_intf_pins spi/s_axi]
connect_bd_intf_net [get_bd_intf_pins axi_cpu_interconnect/M09_AXI] [get_bd_intf_pins spi/s_axi1]
connect_bd_intf_net [get_bd_intf_pins axi_cpu_interconnect/M10_AXI] [get_bd_intf_pins axi_ad5441_dma/s_axi]
connect_bd_intf_net [get_bd_intf_pins axi_cpu_interconnect/M11_AXI] [get_bd_intf_pins spi1/s_axi]
connect_bd_intf_net [get_bd_intf_pins axi_cpu_interconnect/M12_AXI] [get_bd_intf_pins spi1/s_axi1]
connect_bd_intf_net [get_bd_intf_pins axi_cpu_interconnect/M13_AXI] [get_bd_intf_pins axi_iic_0/S_AXI]
connect_bd_intf_net [get_bd_intf_pins axi_cpu_interconnect/M14_AXI] [get_bd_intf_pins axi_gpio_teds/S_AXI]
connect_bd_intf_net [get_bd_intf_pins axi_cpu_interconnect/M15_AXI] [get_bd_intf_pins tacho_quant_0/s_axi_control]
connect_bd_intf_net [get_bd_intf_pins axi_cpu_interconnect/M16_AXI] [get_bd_intf_pins tacho_control_0/s_axi_control]
connect_bd_intf_net [get_bd_intf_pins axi_cpu_interconnect/M17_AXI] [get_bd_intf_pins axi_gpio_dacgate/S_AXI]
connect_bd_intf_net [get_bd_intf_ports IIC_0] [get_bd_intf_pins axi_iic_0/IIC]
connect_bd_intf_net [get_bd_intf_ports iic_fmc] [get_bd_intf_pins axi_iic_fmc/IIC]
connect_bd_intf_net [get_bd_intf_pins axi_iic_main/IIC] [get_bd_intf_pins sys_i2c_mixer/upstream]
connect_bd_intf_net -intf_net fir_1024_j_M_AXIS [get_bd_intf_pins fir_1024_j/M_AXIS_DATA] [get_bd_intf_pins fir_1024_s2/S_AXIS_DATA]
connect_bd_intf_net -intf_net fir_1024_s2_M_AXIS [get_bd_intf_pins fir_1024_s2/M_AXIS_DATA] [get_bd_intf_pins streamToData_0/IN1024OUT8192]
connect_bd_intf_net -intf_net fir_131072_u_M_AXIS [get_bd_intf_pins fir_131072_u/M_AXIS_DATA] [get_bd_intf_pins streamToData_0/IN131072OUT262144]
connect_bd_intf_net -intf_net fir_16384_j_M_AXIS [get_bd_intf_pins fir_16384_j/M_AXIS_DATA] [get_bd_intf_pins fir_16384_s2/S_AXIS_DATA]
connect_bd_intf_net -intf_net fir_16384_s2_M_AXIS [get_bd_intf_pins fir_16384_s2/M_AXIS_DATA] [get_bd_intf_pins streamToData_0/IN16384OUT65536]
connect_bd_intf_net -intf_net fir_2048_j_M_AXIS [get_bd_intf_pins fir_2048_j/M_AXIS_DATA] [get_bd_intf_pins fir_2048_s2/S_AXIS_DATA]
connect_bd_intf_net -intf_net fir_2048_s2_M_AXIS [get_bd_intf_pins fir_2048_s2/M_AXIS_DATA] [get_bd_intf_pins streamToData_0/IN2048OUT8192]
connect_bd_intf_net -intf_net fir_262144_u_M_AXIS [get_bd_intf_pins fir_262144_u/M_AXIS_DATA] [get_bd_intf_pins streamToData_0/IN262144OUT262144]
connect_bd_intf_net -intf_net fir_32768_j_M_AXIS [get_bd_intf_pins fir_32768_j/M_AXIS_DATA] [get_bd_intf_pins fir_32768_s2/S_AXIS_DATA]
connect_bd_intf_net -intf_net fir_32768_s2_M_AXIS [get_bd_intf_pins fir_32768_s2/M_AXIS_DATA] [get_bd_intf_pins streamToData_0/IN32768OUT65536]
connect_bd_intf_net -intf_net fir_4096_j_M_AXIS [get_bd_intf_pins fir_4096_j/M_AXIS_DATA] [get_bd_intf_pins fir_4096_s2/S_AXIS_DATA]
connect_bd_intf_net -intf_net fir_4096_s2_M_AXIS [get_bd_intf_pins fir_4096_s2/M_AXIS_DATA] [get_bd_intf_pins streamToData_0/IN4096OUT8192]
connect_bd_intf_net -intf_net fir_65536_u_M_AXIS [get_bd_intf_pins fir_65536_u/M_AXIS_DATA] [get_bd_intf_pins streamToData_0/IN65536OUT262144]
connect_bd_intf_net -intf_net fir_8192_j_M_AXIS [get_bd_intf_pins fir_8192_j/M_AXIS_DATA] [get_bd_intf_pins fir_8192_s2/S_AXIS_DATA]
connect_bd_intf_net -intf_net fir_8192_s2_M_AXIS [get_bd_intf_pins fir_8192_s2/M_AXIS_DATA] [get_bd_intf_pins streamToData_0/IN8192OUT65536]
connect_bd_intf_net -intf_net fir_cola_u_M_AXIS [get_bd_intf_pins fir_cola_u/M_AXIS_DATA] [get_bd_intf_pins streamToData_0/COLAIN65536OUT262144]
connect_bd_intf_net [get_bd_intf_ports ddr] [get_bd_intf_pins sys_ps7/DDR]
connect_bd_intf_net [get_bd_intf_ports fixed_io] [get_bd_intf_pins sys_ps7/FIXED_IO]
connect_bd_intf_net [get_bd_intf_pins ad7768_dma_2/fifo_wr] [get_bd_intf_pins util_ad7768_adc_pack/packed_fifo_wr]
connect_bd_net [get_bd_pins ADCCountsToFloat8_0/out0] [get_bd_pins util_ad7768_adc_pack/fifo_wr_data_0]
connect_bd_net [get_bd_pins ADCCountsToFloat8_0/out1] [get_bd_pins util_ad7768_adc_pack/fifo_wr_data_1]
connect_bd_net [get_bd_pins ADCCountsToFloat8_0/out2] [get_bd_pins util_ad7768_adc_pack/fifo_wr_data_2]
connect_bd_net [get_bd_pins ADCCountsToFloat8_0/out3] [get_bd_pins util_ad7768_adc_pack/fifo_wr_data_3]
connect_bd_net [get_bd_pins ADCCountsToFloat8_0/out4] [get_bd_pins util_ad7768_adc_pack/fifo_wr_data_4]
connect_bd_net [get_bd_pins ADCCountsToFloat8_0/out5] [get_bd_pins util_ad7768_adc_pack/fifo_wr_data_5]
connect_bd_net [get_bd_pins ADCCountsToFloat8_0/out6] [get_bd_pins util_ad7768_adc_pack/fifo_wr_data_6]
connect_bd_net [get_bd_pins ADCCountsToFloat8_0/out7] [get_bd_pins util_ad7768_adc_pack/fifo_wr_data_7]
connect_bd_net [get_bd_pins ADCCountsToFloat8_0/usr_gpio_o0] [get_bd_ports usr_gpio_o_0]
connect_bd_net [get_bd_pins ADCCountsToFloat8_0/usr_gpio_o1] [get_bd_ports usr_gpio_o_1]
connect_bd_net [get_bd_pins ADCCountsToFloat8_0/usr_gpio_o2] [get_bd_ports usr_gpio_o_2]
connect_bd_net [get_bd_pins ADCCountsToFloat8_0/usr_gpio_o3] [get_bd_ports usr_gpio_o_3]
connect_bd_net [get_bd_pins ADCCountsToFloat8_0/usr_gpio_o4] [get_bd_ports usr_gpio_o_4]
connect_bd_net [get_bd_pins ADCCountsToFloat8_0/usr_gpio_o5] [get_bd_ports usr_gpio_o_5]
connect_bd_net [get_bd_pins ADCCountsToFloat8_0/usr_gpio_o6] [get_bd_ports usr_gpio_o_6]
connect_bd_net [get_bd_pins ADCCountsToFloat8_0/usr_gpio_o7] [get_bd_ports usr_gpio_o_7]
connect_bd_net [get_bd_pins ColaGate_0/dataOut] [get_bd_pins spi1/dma_data]
connect_bd_net [get_bd_pins DacStartGate_0/armed_o] [get_bd_pins dacgate_status_concat/In0]
connect_bd_net [get_bd_pins DacStartGate_0/cola_dma_enable_o] [get_bd_pins spi1/dma_enable]
connect_bd_net [get_bd_pins DacStartGate_0/cola_drain_o] [get_bd_pins cola_rd_or/Op2]
connect_bd_net [get_bd_pins DacStartGate_0/dma_enable_o] [get_bd_pins spi/dma_enable]
connect_bd_net [get_bd_pins DacStartGate_0/fifo_rd_en_o] [get_bd_pins fifo_generator_1/rd_en]
connect_bd_net [get_bd_pins DacStartGate_0/prefilled_o] [get_bd_pins dacgate_status_concat/In1]
connect_bd_net [get_bd_pins DacStartGate_0/started_o] [get_bd_pins dacgate_status_concat/In2]
connect_bd_net [get_bd_pins DacStartGate_0/sync_count_o] [get_bd_pins dacgate_status_concat/In3]
connect_bd_net [get_bd_pins DriveScale_0/ColaOutput] [get_bd_pins fifo_generator_2/din]
connect_bd_net [get_bd_pins DriveScale_0/interp] [get_bd_pins ila_dacspi/probe3]
connect_bd_net [get_bd_pins DriveScale_0/loopback] [get_bd_pins fifo_generator_4/din]
connect_bd_net [get_bd_pins DriveScale_0/loopback_ap_vld] \
  [get_bd_pins fifo_generator_4/wr_en] [get_bd_pins fifo_generator_2/wr_en] [get_bd_pins ila_dacspi/probe0]
connect_bd_net [get_bd_pins GND_1/dout] \
  [get_bd_pins sys_concat_intc/In0] [get_bd_pins sys_concat_intc/In1] [get_bd_pins sys_concat_intc/In2] \
  [get_bd_pins sys_concat_intc/In3] [get_bd_pins sys_concat_intc/In4] [get_bd_pins sys_concat_intc/In15]
connect_bd_net [get_bd_pins StartGen_0/strtpuls] [get_bd_pins spi_16_peripheral_0/write_enable]
connect_bd_net [get_bd_pins Synch_0/ap_return] [get_bd_pins util_vector_logic_1/Op2]
connect_bd_net [get_bd_pins Synch_0/bRunningAcqOut] [get_bd_pins ColaGate_0/bRunningAcq] [get_bd_pins packreset_run_not/Op1]
connect_bd_net [get_bd_pins ad7768_dma_2/irq] [get_bd_pins sys_concat_intc/In10]
connect_bd_net [get_bd_pins ad7768_dma/irq] [get_bd_pins sys_concat_intc/In13]
connect_bd_net [get_bd_pins axi_ad5441_dma/fifo_rd_valid] \
  [get_bd_pins ColaCounts_0/ap_start] [get_bd_pins fifo_generator_3/wr_en] [get_bd_pins DacStartGate_0/cola_wr_valid]
connect_bd_net [get_bd_pins axi_ad5441_dma/irq] [get_bd_pins sys_concat_intc/In7]
connect_bd_net [get_bd_pins axi_ad5766_dac_dma/fifo_rd_dout] [get_bd_pins fifo_generator_1/din]
connect_bd_net [get_bd_pins axi_ad5766_dac_dma/fifo_rd_valid] [get_bd_pins fifo_generator_1/wr_en] [get_bd_pins DacStartGate_0/dma_wr_valid]
connect_bd_net [get_bd_pins axi_ad5766_dac_dma/fifo_rd_xfer_req] [get_bd_pins spi/dma_xfer_req]
connect_bd_net [get_bd_pins axi_ad5766_dac_dma/irq] [get_bd_pins sys_concat_intc/In9]
connect_bd_net [get_bd_pins axi_ad7768_adc/adc_clk] \
  [get_bd_pins util_ad7768_adc_pack/clk] [get_bd_pins ad7768_dma/fifo_wr_clk] [get_bd_pins ad7768_dma_2/fifo_wr_clk] \
  [get_bd_pins fifo_generator_0/wr_clk] [get_bd_pins fifo_generator_1/rd_clk] [get_bd_pins fir_1024_j/aclk] \
  [get_bd_pins fir_1024_s2/aclk] [get_bd_pins fir_2048_j/aclk] [get_bd_pins fir_2048_s2/aclk] [get_bd_pins fir_4096_j/aclk] \
  [get_bd_pins fir_4096_s2/aclk] [get_bd_pins fir_8192_j/aclk] [get_bd_pins fir_8192_s2/aclk] [get_bd_pins fir_16384_j/aclk] \
  [get_bd_pins fir_16384_s2/aclk] [get_bd_pins fir_32768_j/aclk] [get_bd_pins fir_32768_s2/aclk] \
  [get_bd_pins fir_65536_u/aclk] [get_bd_pins fir_131072_u/aclk] [get_bd_pins fir_262144_u/aclk] \
  [get_bd_pins fir_cola_u/aclk] [get_bd_pins rst_axi_ad7768_adc_33M/slowest_sync_clk] [get_bd_pins fifo_generator_4/clk] \
  [get_bd_pins ADCCountsToFloat8_0/ap_clk] [get_bd_pins fifo_generator_3/rd_clk] [get_bd_pins fifo_generator_5/wr_clk] \
  [get_bd_pins fifo_generator_2/clk] [get_bd_pins streamToData_0/ap_clk] [get_bd_pins Synch_0/ap_clk] \
  [get_bd_pins axi_adc_cc/m_axi_aclk] [get_bd_pins axi_adc_interconnect/ACLK] [get_bd_pins axi_adc_interconnect/S00_ACLK] \
  [get_bd_pins axi_adc_interconnect/M00_ACLK] [get_bd_pins axi_adc_interconnect/M01_ACLK] \
  [get_bd_pins axi_adc_interconnect/M02_ACLK] [get_bd_pins axi_adc_interconnect/M03_ACLK] [get_bd_pins ila_dacspi/clk] \
  [get_bd_pins dac_sync_strobe_0/adc_clk] [get_bd_pins DacStartGate_0/adc_clk] [get_bd_pins DriveScale_0/ap_clk]
connect_bd_net [get_bd_pins axi_ad7768_adc/adc_data] [get_bd_pins ad7768_dma/fifo_wr_din]
connect_bd_net [get_bd_pins axi_ad7768_adc/adc_data_0] [get_bd_pins ADCCountsToFloat8_0/input0]
connect_bd_net [get_bd_pins axi_ad7768_adc/adc_data_1] [get_bd_pins ADCCountsToFloat8_0/input1]
